# EasyEDA Pro project N01-H6.epro, schematic Schematic1_1, sheets 1 to 5 of 7

## Sheets
1 Lpddr3: Assembly Variant: Basic; Board Name: Board1_1; Create Date: 2026-11-21; Page Name: Lpddr3; Project Name: N01｜全志 H6 Linux 主板; Schematic Name: Schematic1_1; Update Date: 2026-11-21; Company: 嘉立创EDA; Page Size: A4; Version: V1.0
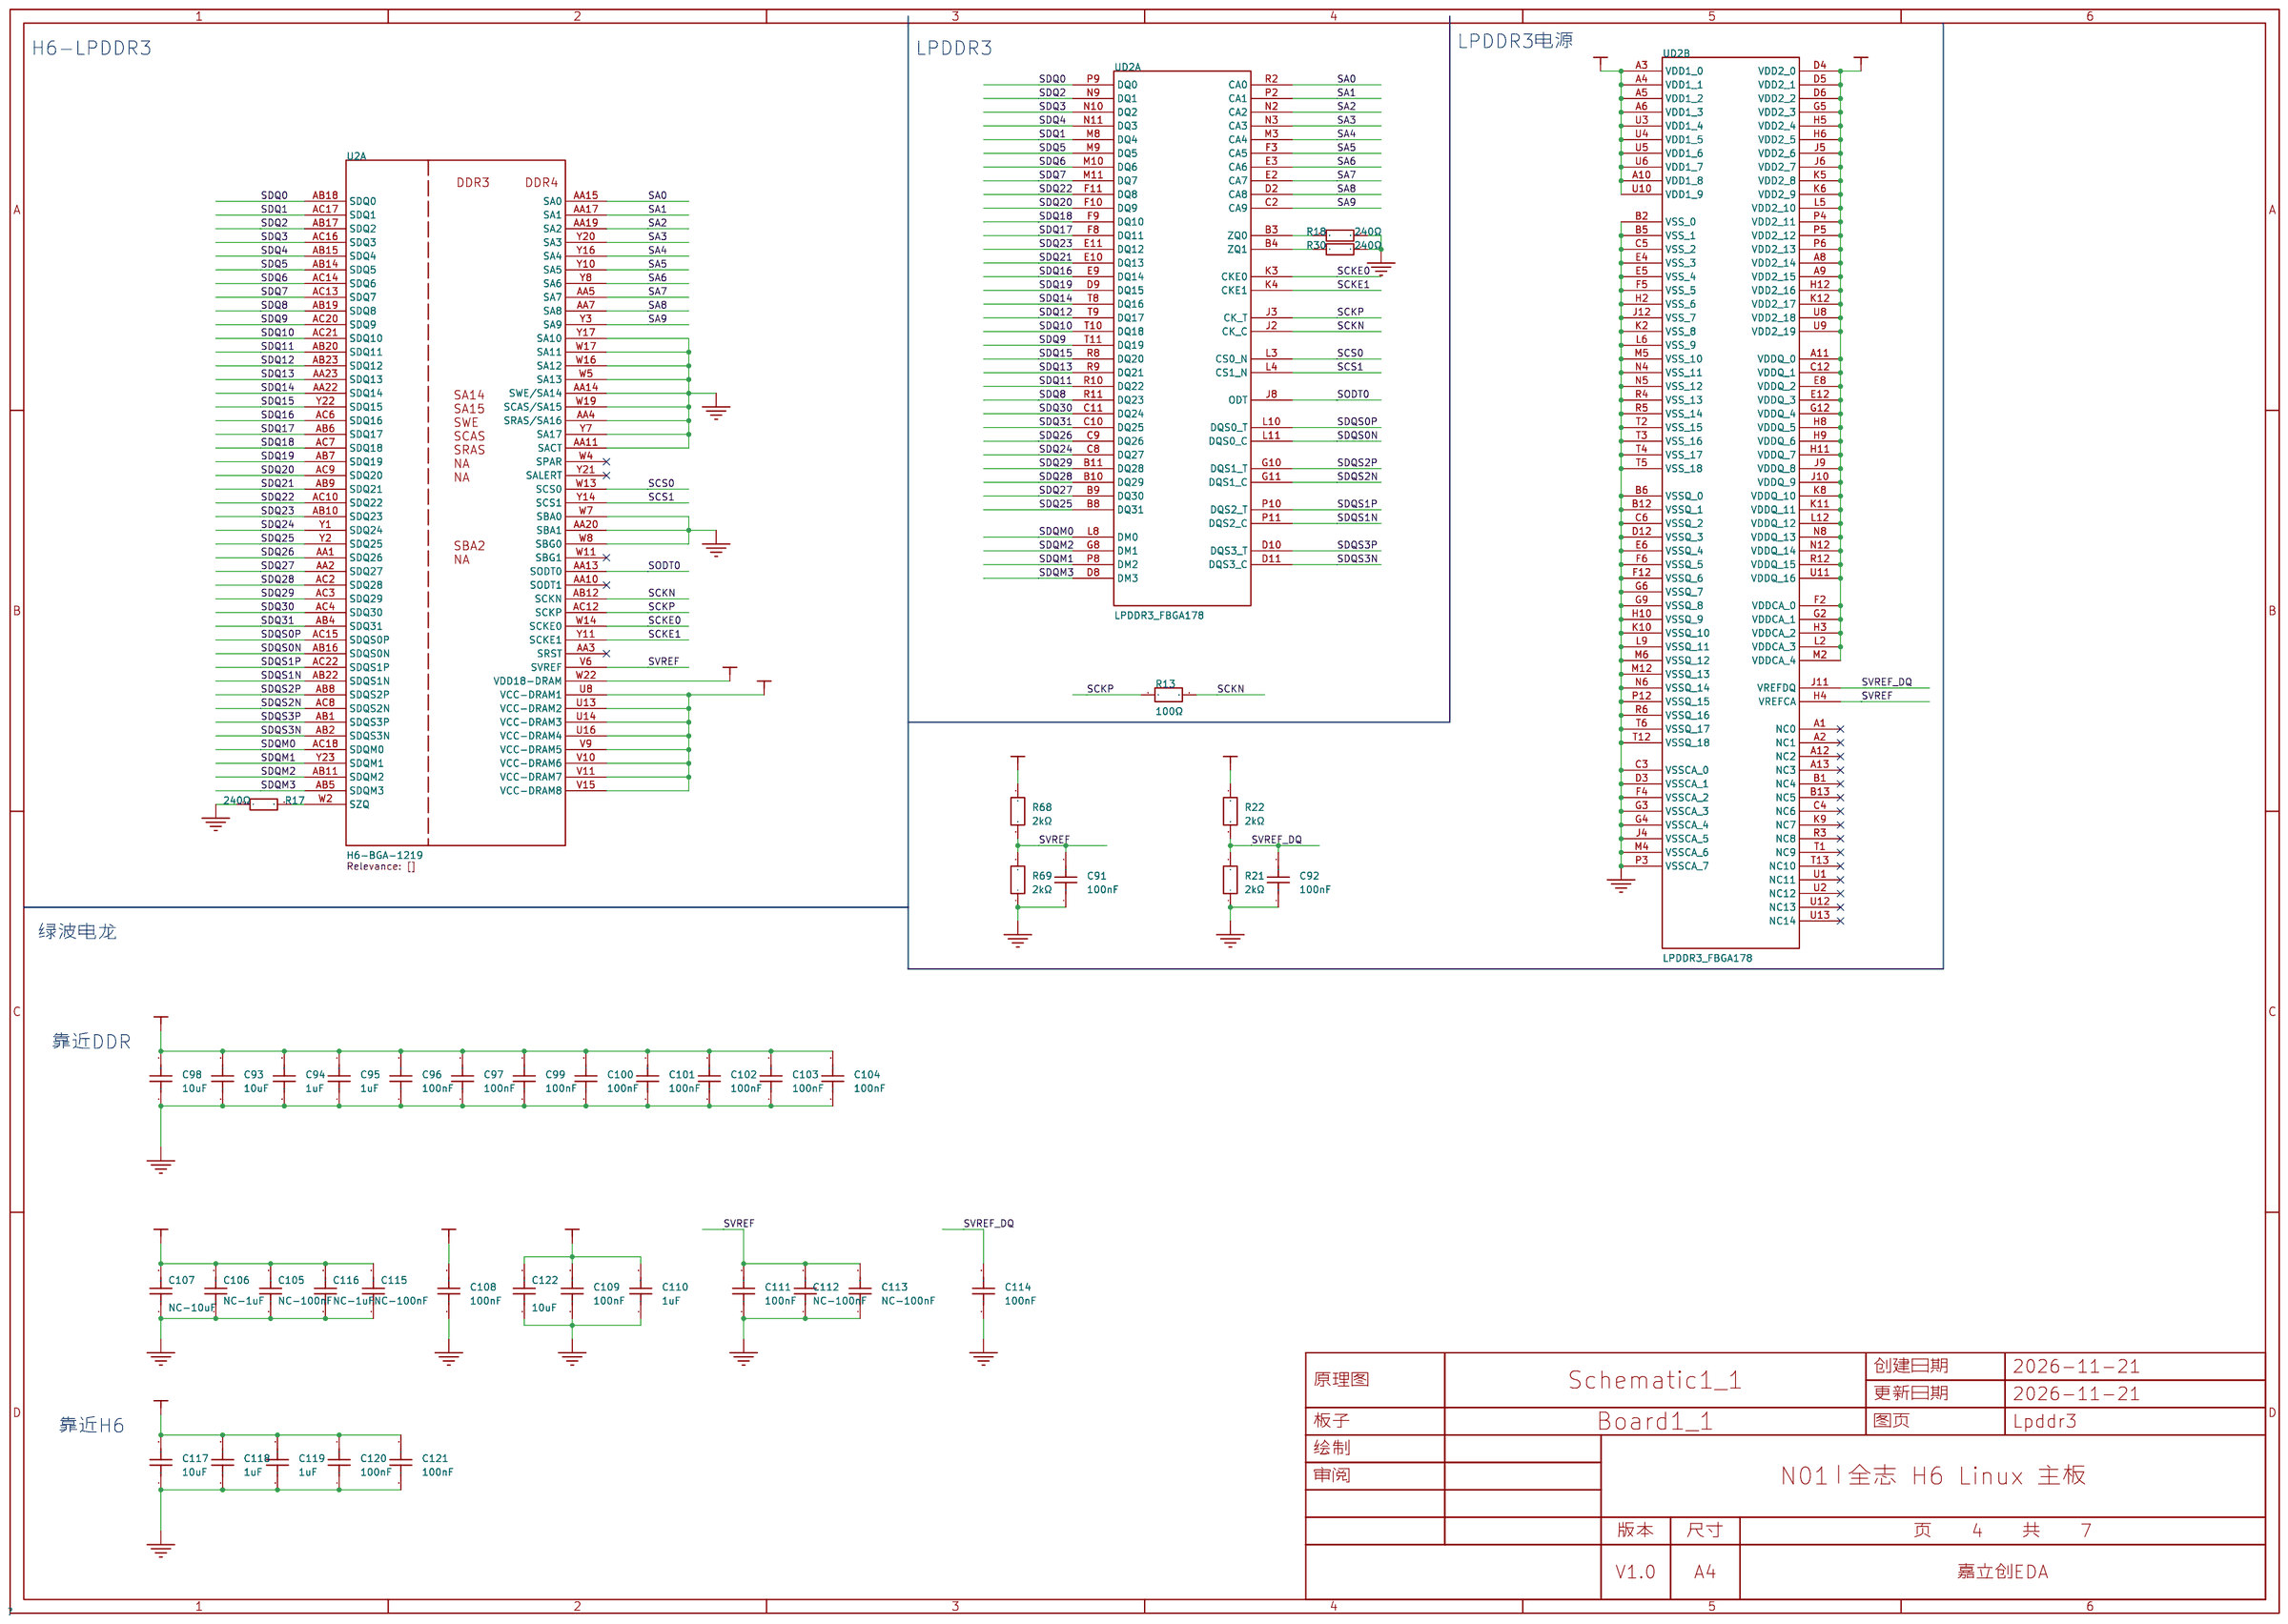
[diagram p0: Lpddr3]
2 ETH,HDMI: Page Name: ETH,HDMI
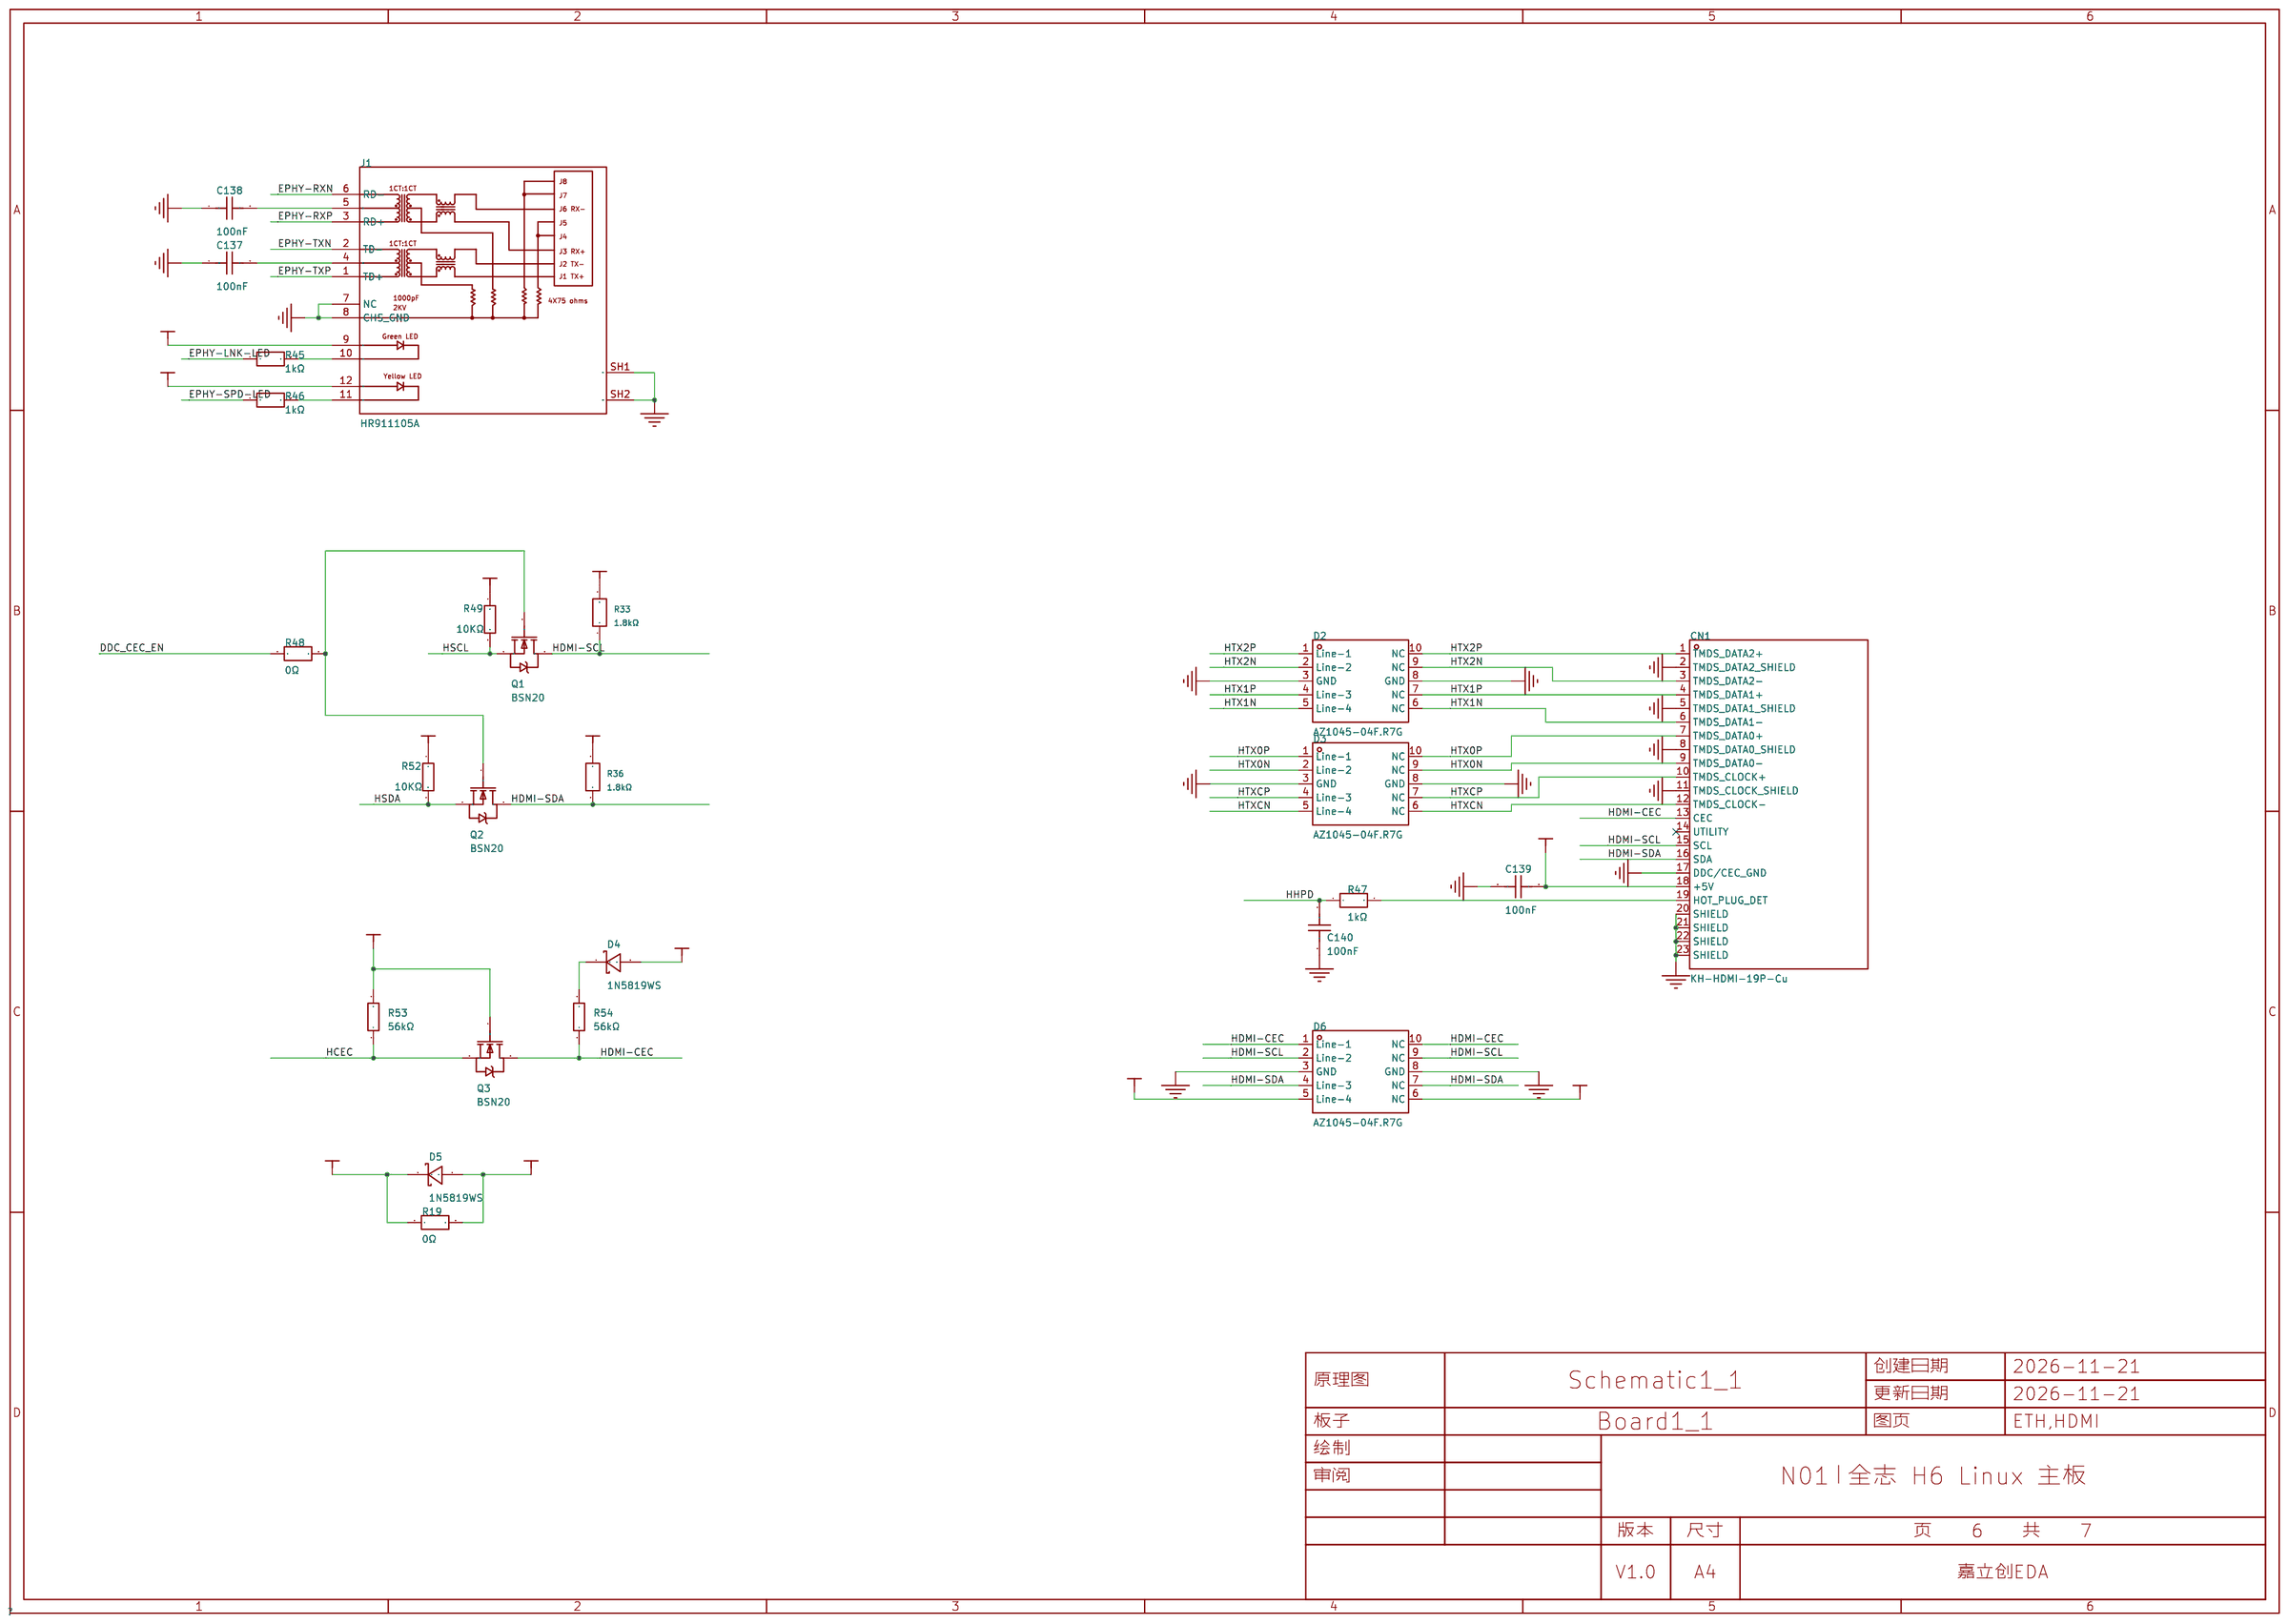
[diagram p1: ETH,HDMI]
3 Power_Tree_1: Page Name: Power_Tree_1
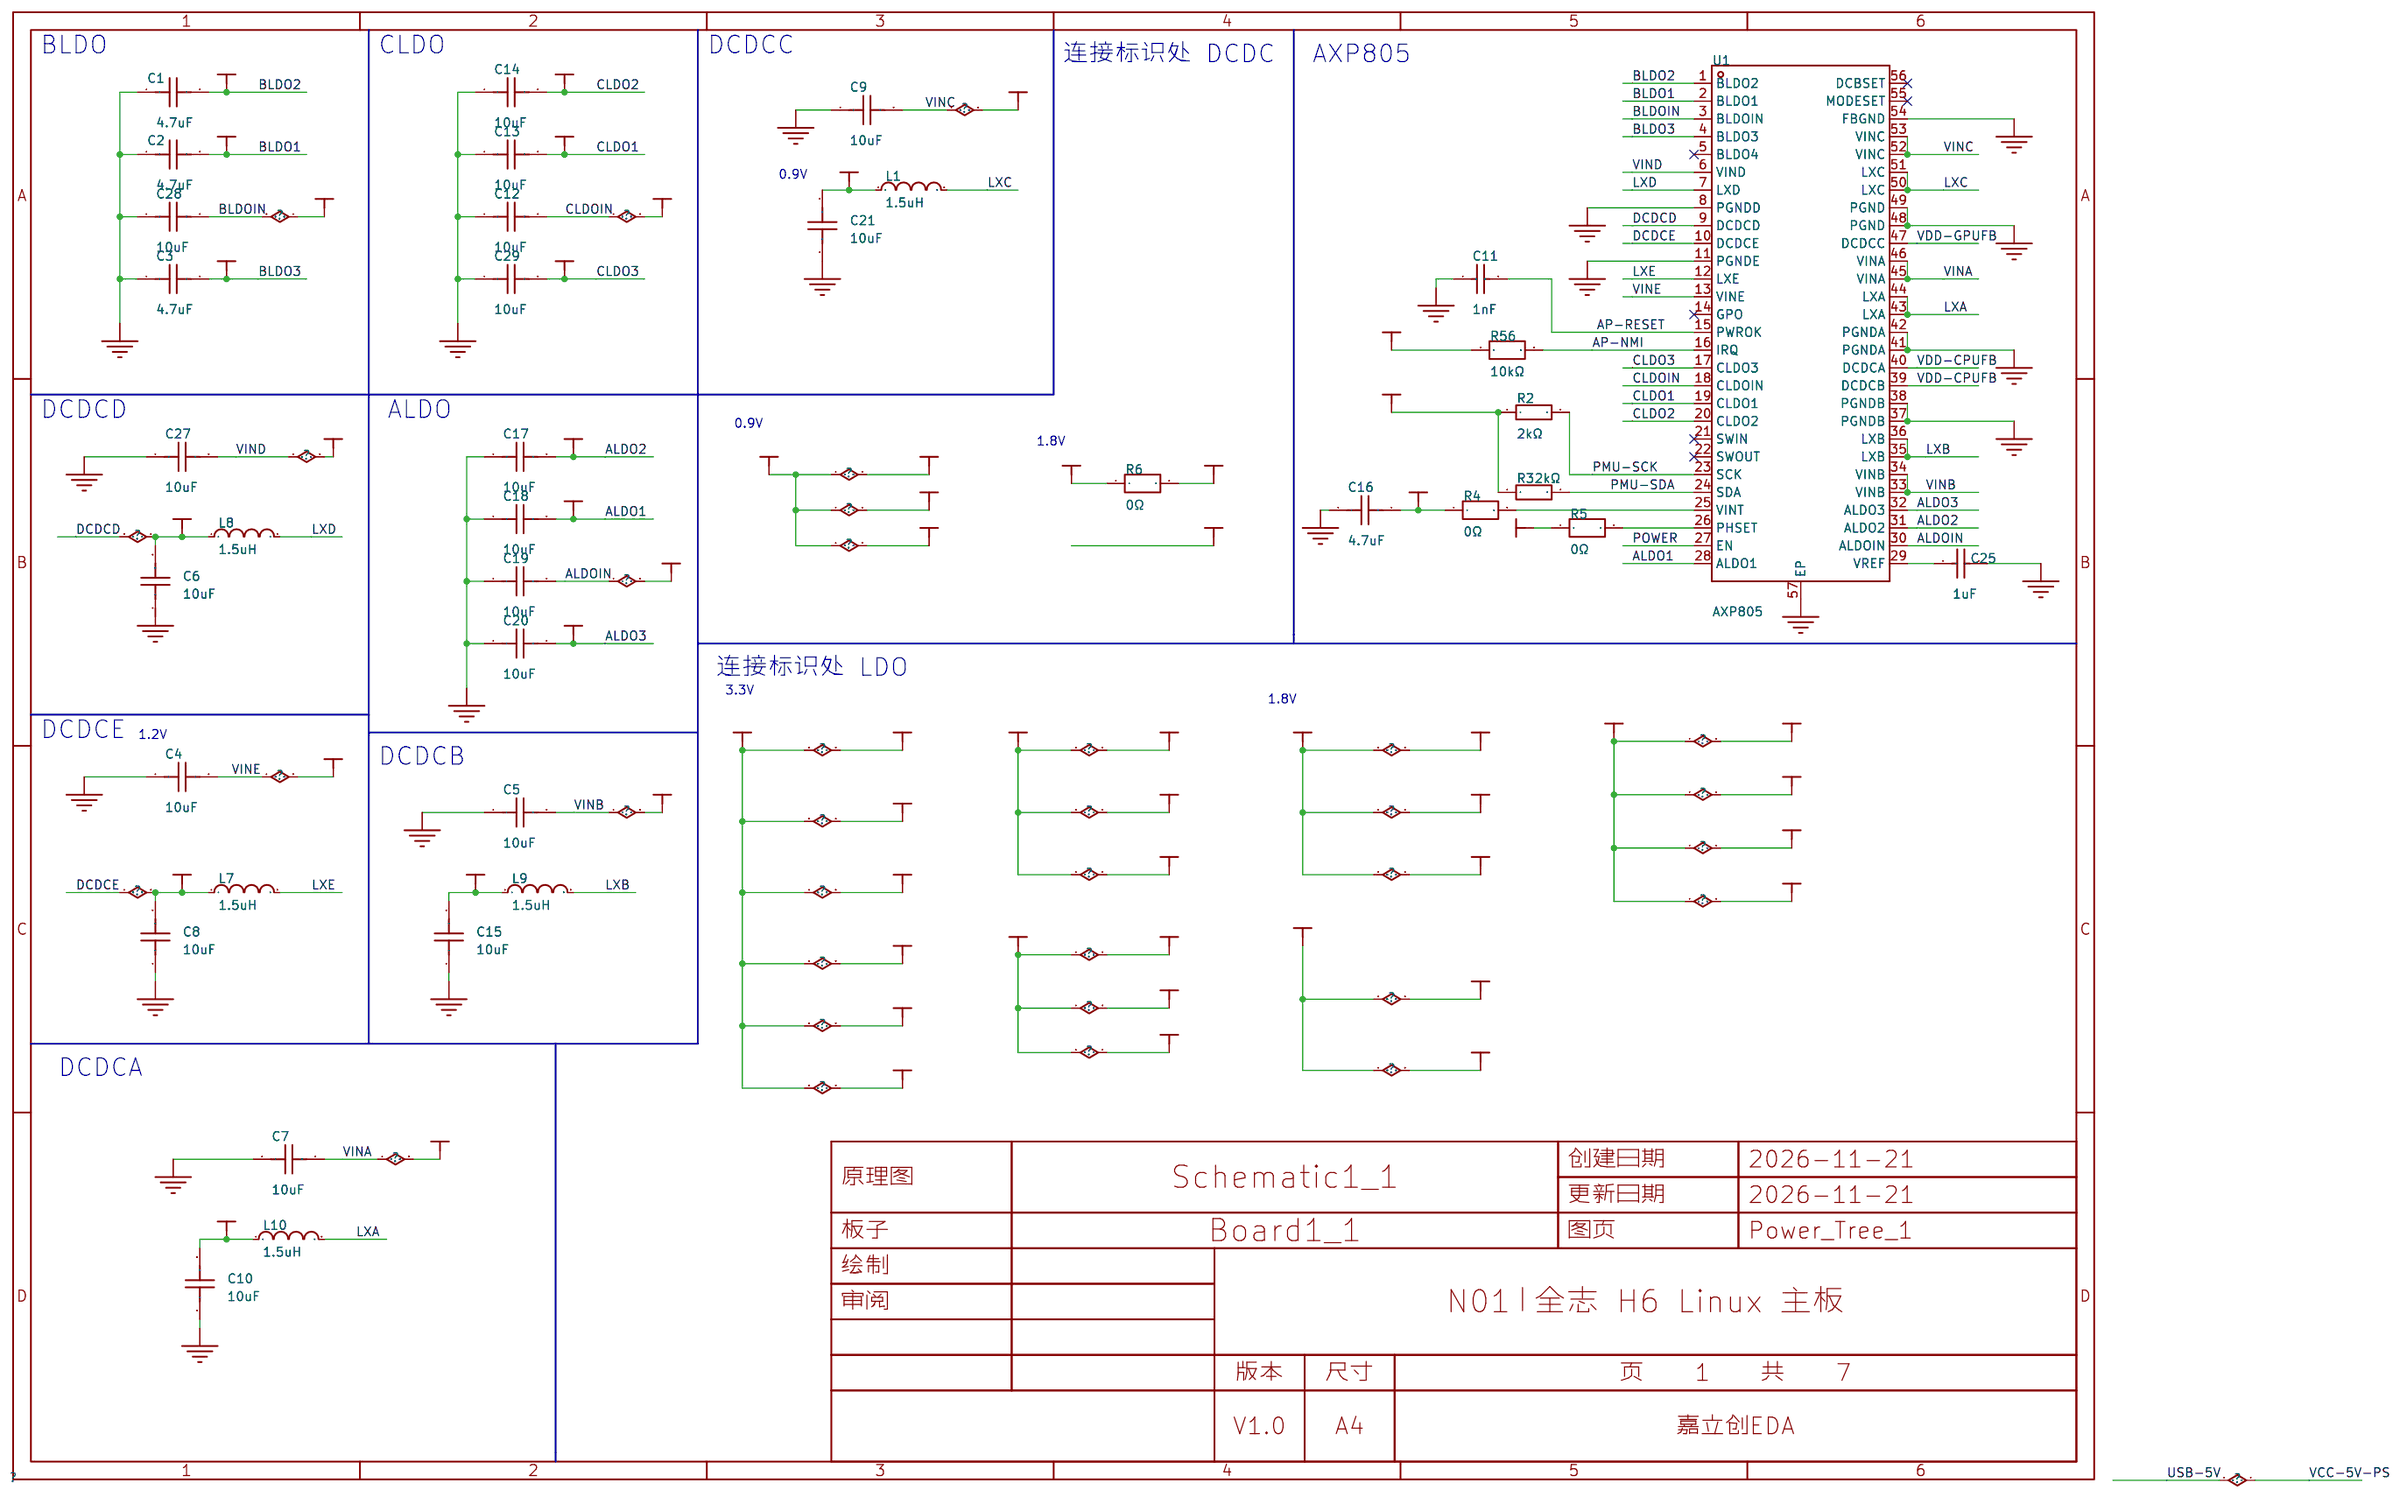
[diagram p2: Power_Tree_1]
4 H6_SOC_2: Page Name: H6_SOC_2
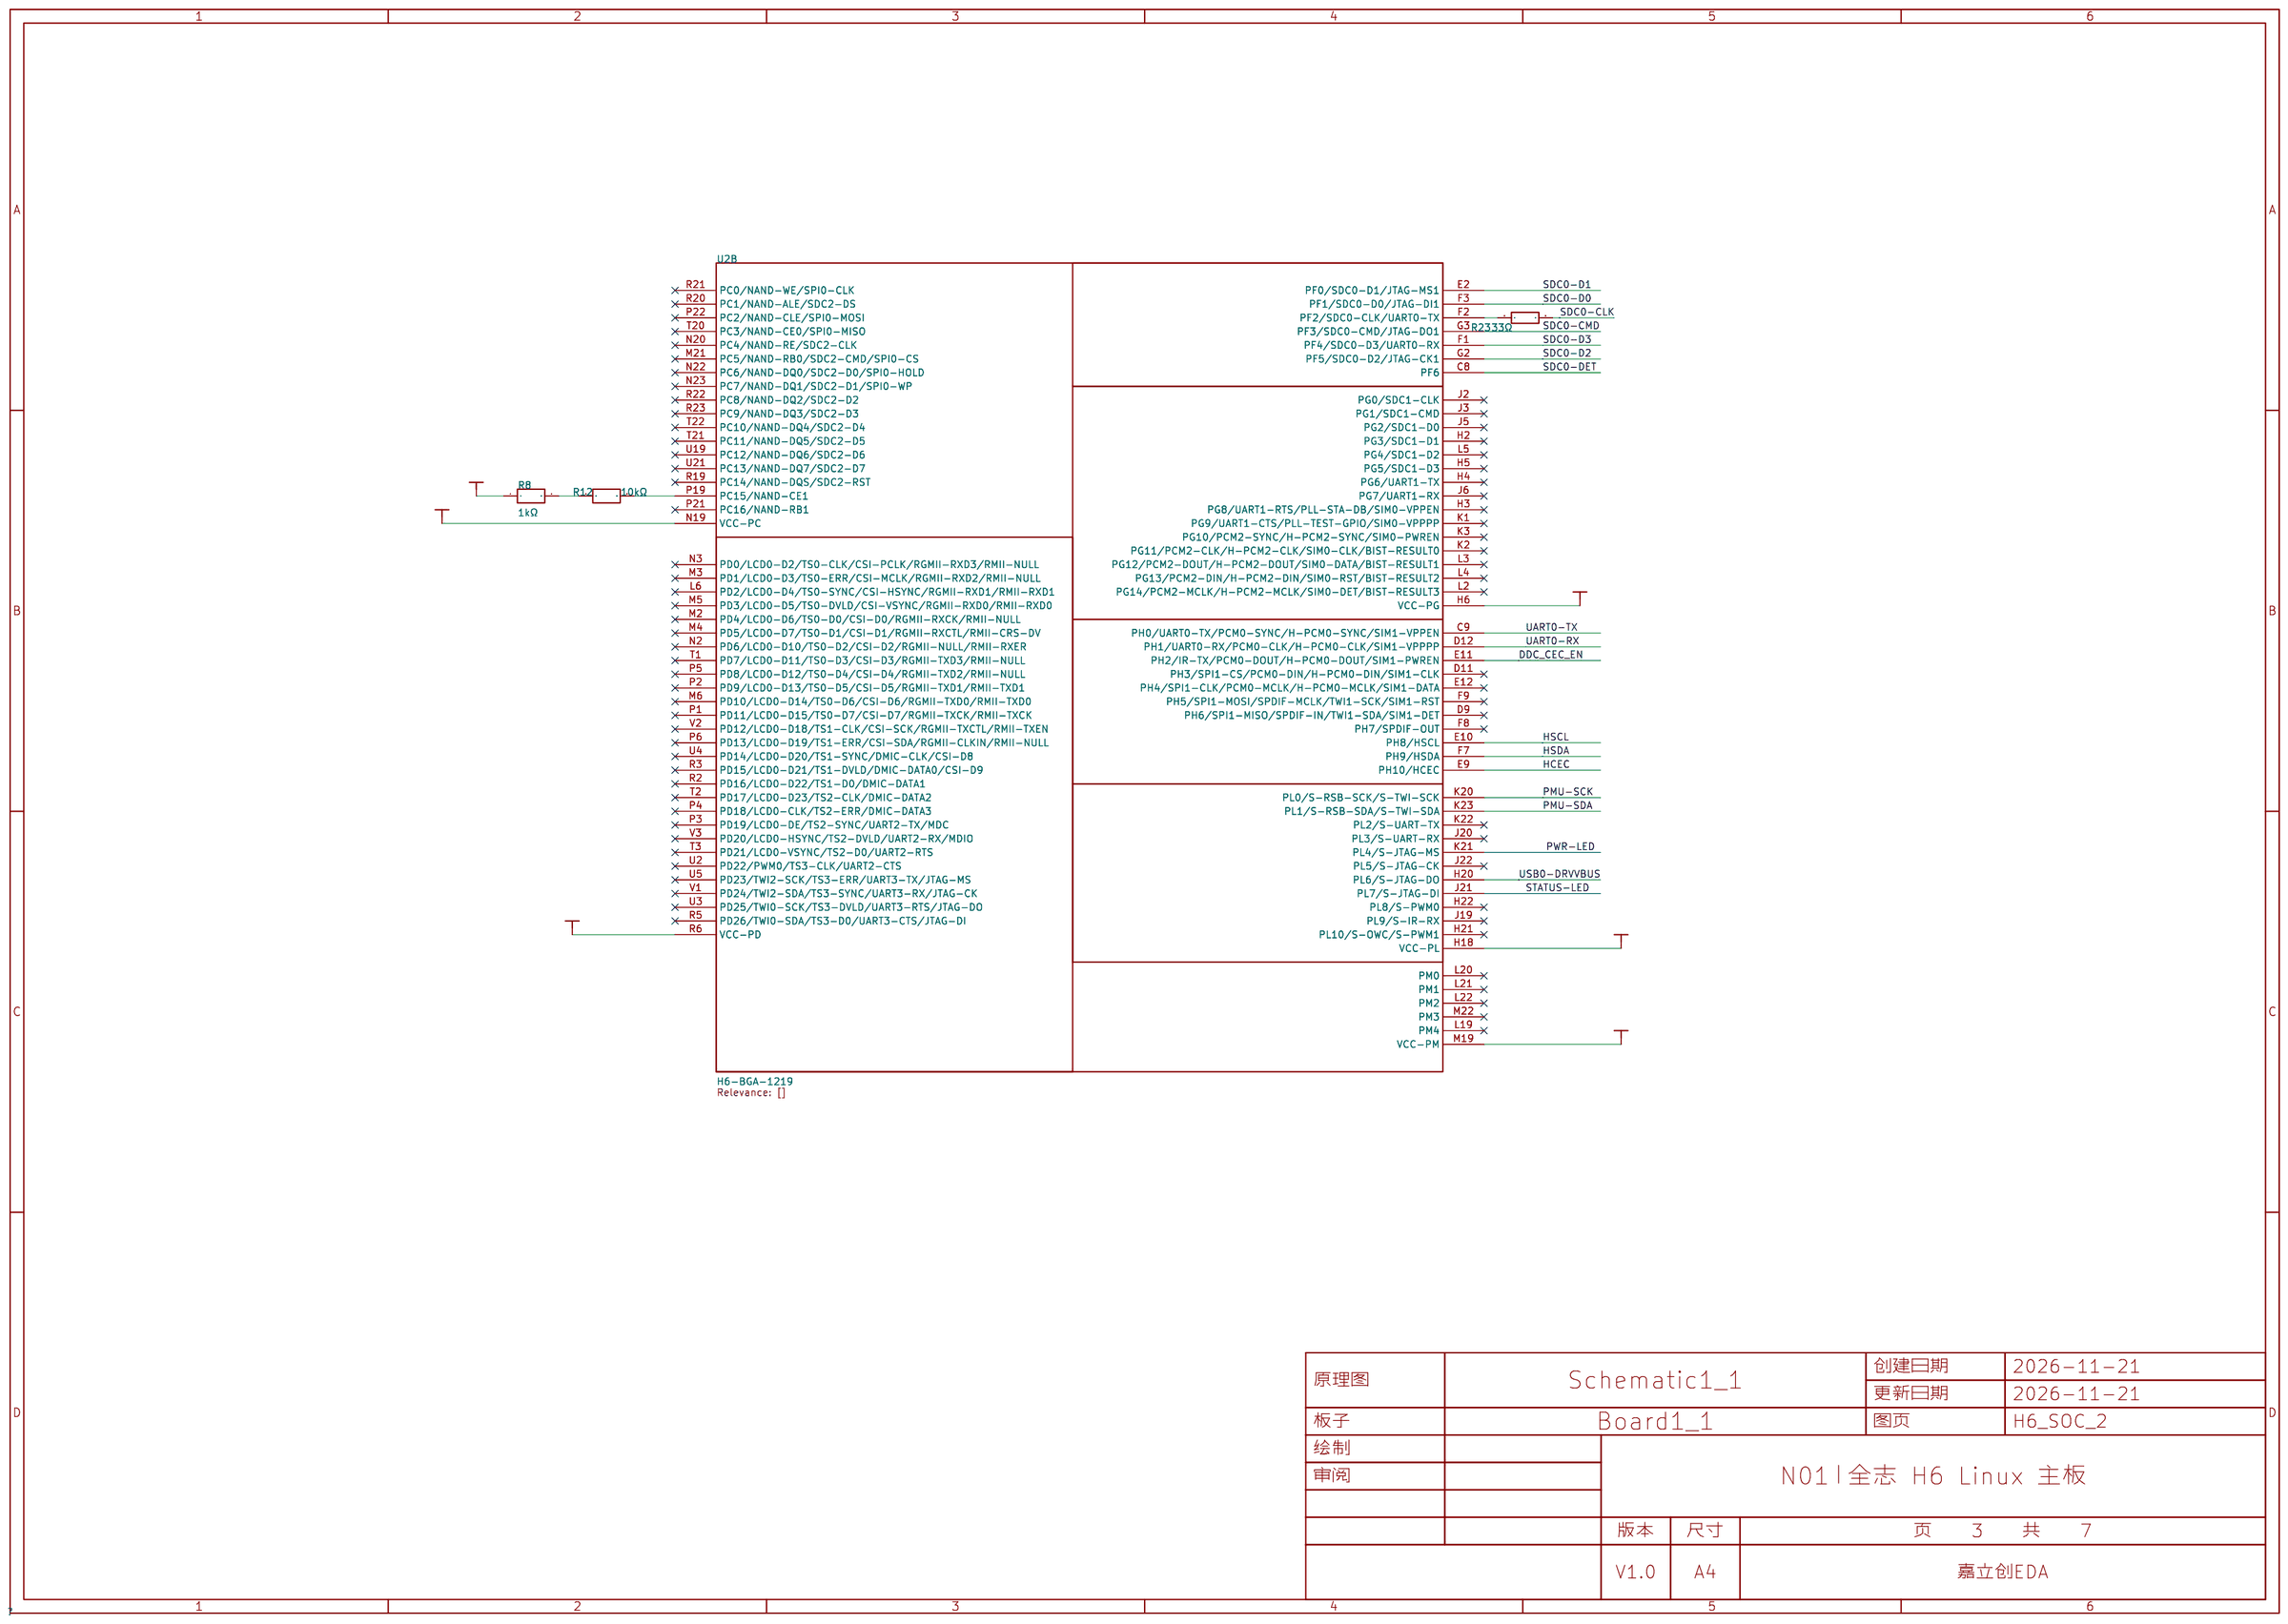
[diagram p3: H6_SOC_2]
5 H6_SOC_1: Page Name: H6_SOC_1
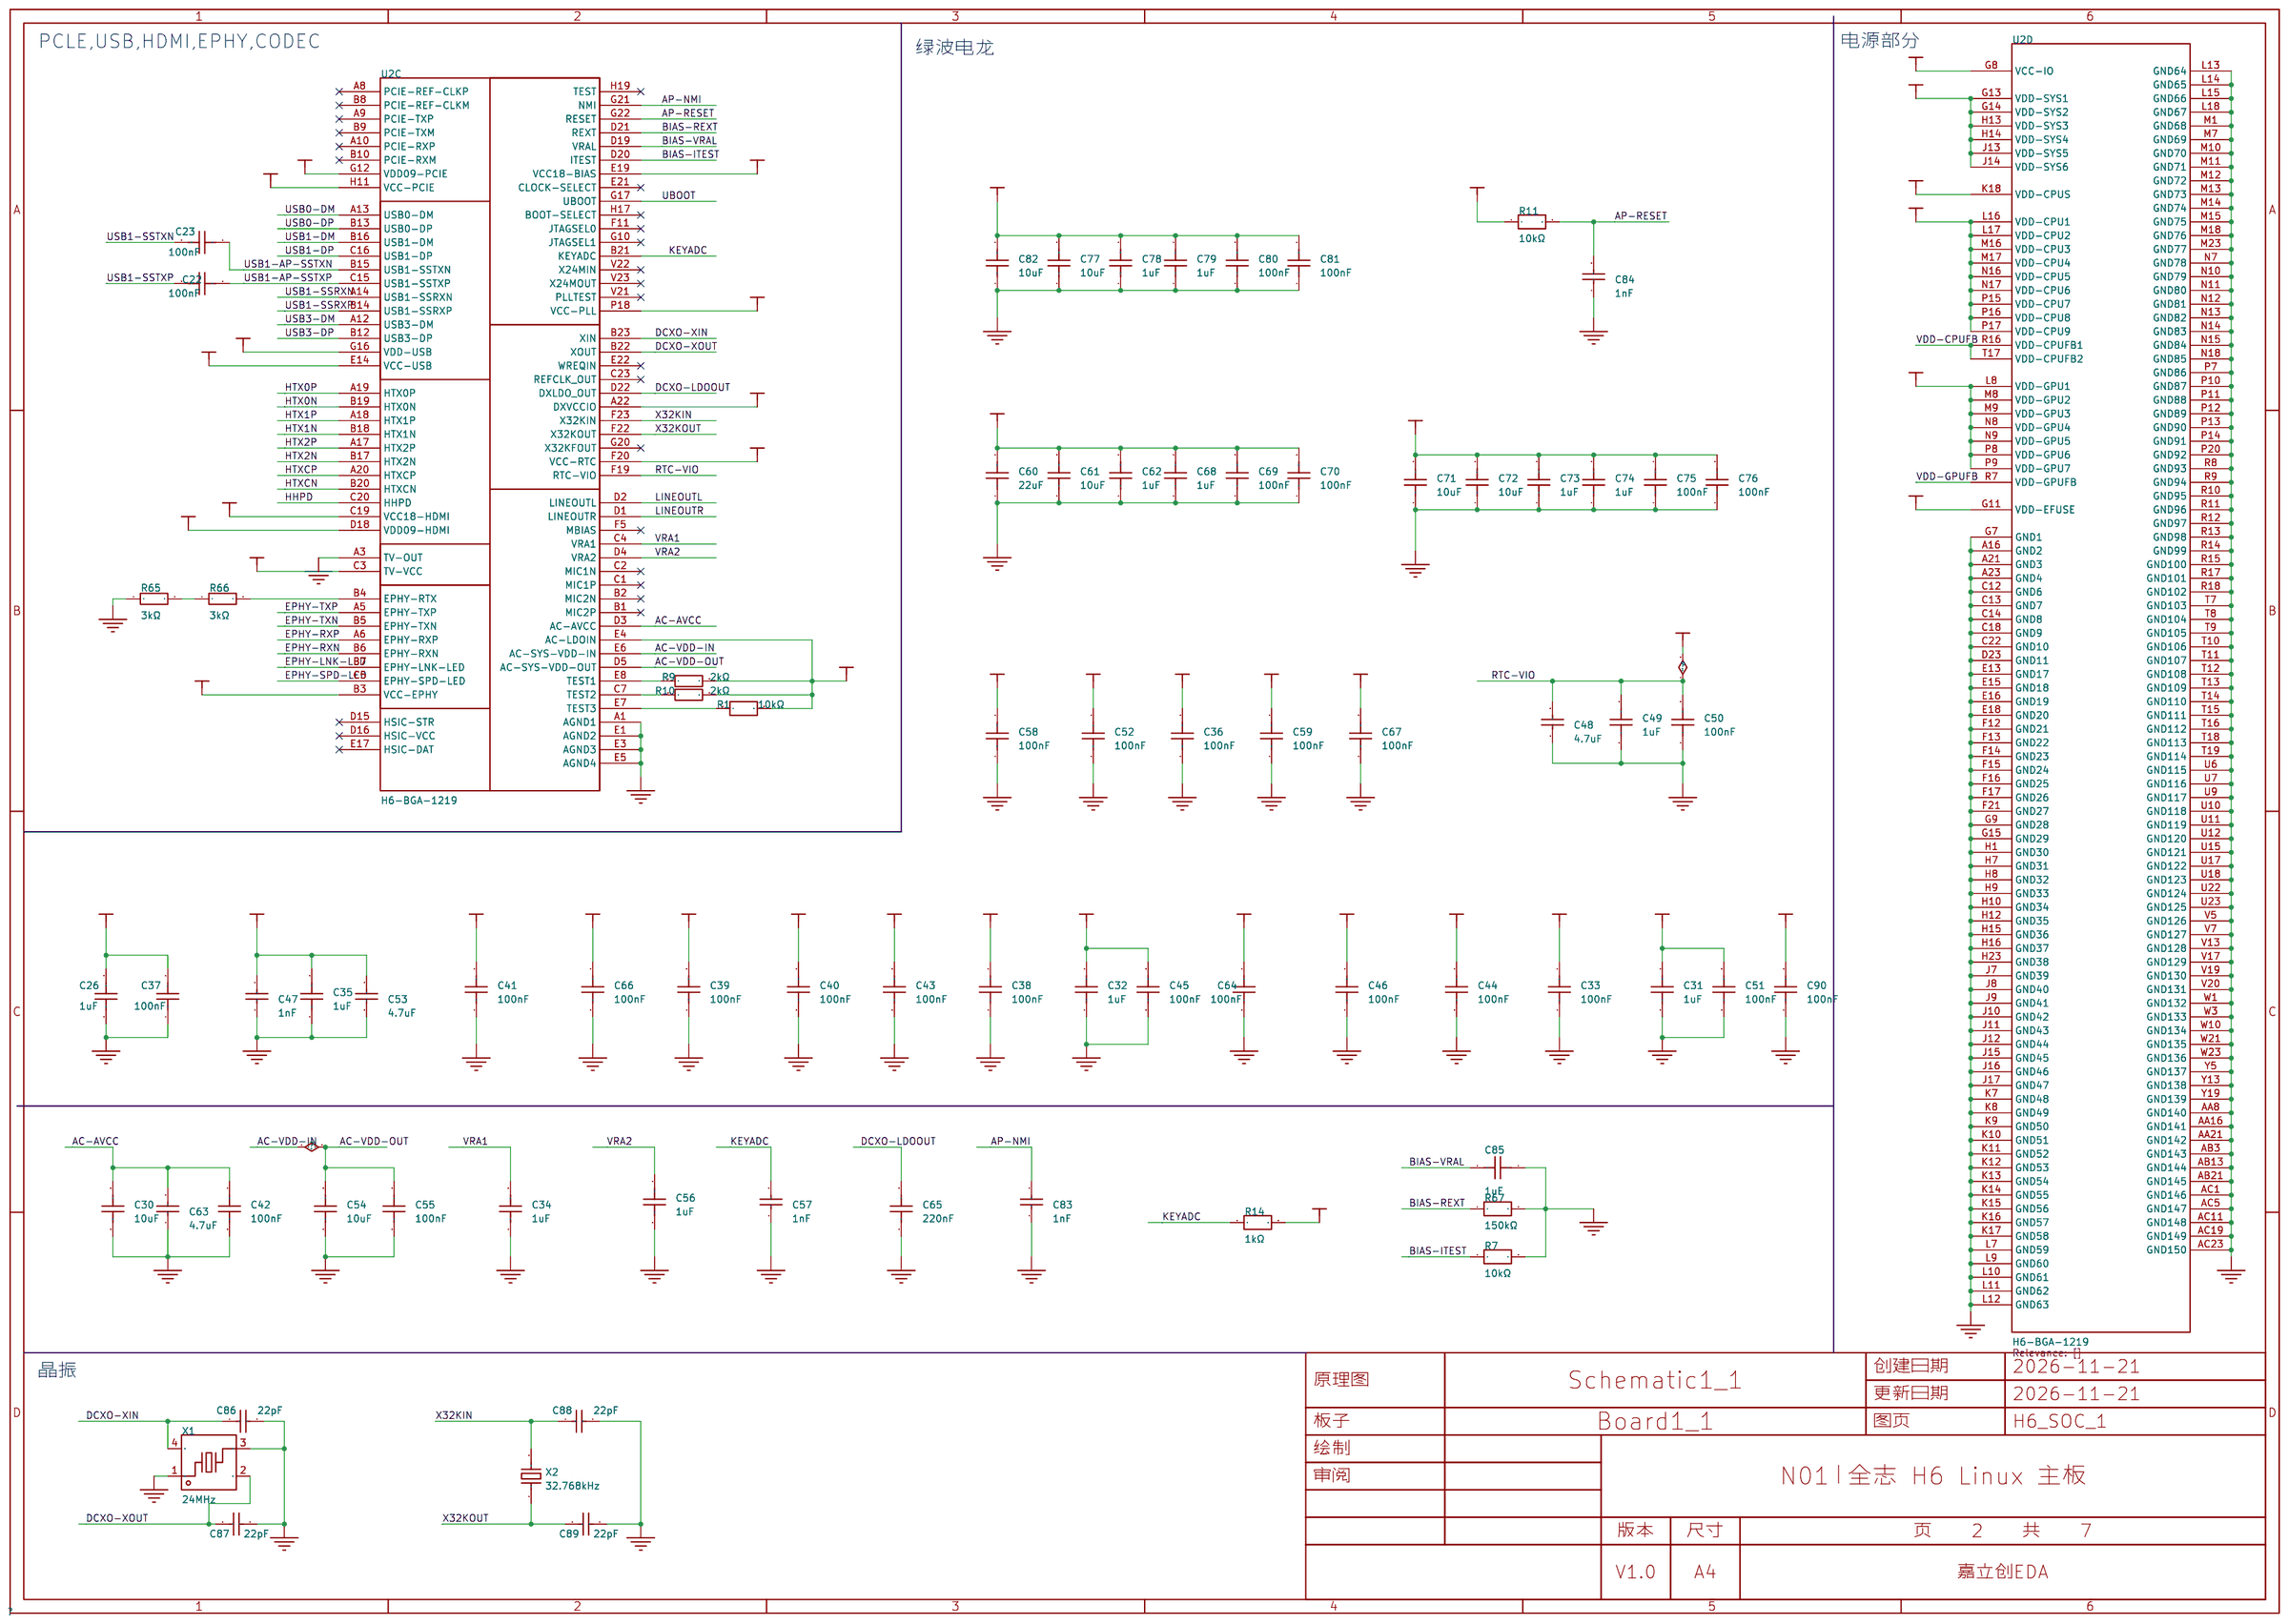
[diagram p4: H6_SOC_1]

## Parts
sheet ETH,HDMI
C137  100nF  [C0603]
C138  100nF  [C0603]
C139  100nF  [C0402]
C140  100nF  [C0402]
CN1  KH-HDMI-19P-Cu  [HDMI-SMD_KH-HDMI-19P-CU]
D2  AZ1045-04F.R7G  [DFN2510-10_L2.5-W1.0-P0.50-BL]
D3  AZ1045-04F.R7G  [DFN2510-10_L2.5-W1.0-P0.50-BL]
D4  1N5819WS  [SOD-323_L1.8-W1.3-LS2.5-RD]
D5  1N5819WS  [SOD-323_L1.8-W1.3-LS2.5-RD]
D6  AZ1045-04F.R7G  [DFN2510-10_L2.5-W1.0-P0.50-BL]
J1  HR911105A  [RJ45-TH_HR911105A]
Q1  BSN20  [SOT-23-3_L2.9-W1.6-P1.90-LS2.8-BR]
Q2  BSN20  [SOT-23-3_L2.9-W1.6-P1.90-LS2.8-BR]
Q3  BSN20  [SOT-23-3_L2.9-W1.6-P1.90-LS2.8-BR]
R19  0Ω  [R0805]
R33  1.8kΩ  [R0805]
R36  1.8kΩ  [R0805]
R45  1kΩ  [R0805]
R46  1kΩ  [R0805]
R47  1kΩ  [R0805]
R48  0Ω  [R0805]
R49  10KΩ  [R0805]
R52  10KΩ  [R0805]
R53  56kΩ  [R0805]
R54  56kΩ  [R0805]
sheet H6_SOC_1
C22  100nF  [C0402]
C23  100nF  [C0402]
C26  1uF  [C0402]
C30  10uF  [C0603]
C31  1uF  [C0402]
C32  1uF  [C0402]
C33  100nF  [C0402]
C34  1uF  [C0402]
C35  1uF  [C0402]
C36  100nF  [C0402]
C37  100nF  [C0402]
C38  100nF  [C0402]
C39  100nF  [C0402]
C40  100nF  [C0402]
C41  100nF  [C0402]
C42  100nF  [C0402]
C43  100nF  [C0402]
C44  100nF  [C0402]
C45  100nF  [C0402]
C46  100nF  [C0402]
C47  1nF  [C0402]
C48  4.7uF  [C0603]
C49  1uF  [C0402]
C50  100nF  [C0402]
C51  100nF  [C0402]
C52  100nF  [C0402]
C53  4.7uF  [C0603]
C54  10uF  [C0603]
C55  100nF  [C0402]
C56  1uF  [C0402]
C57  1nF  [C0402]
C58  100nF  [C0402]
C59  100nF  [C0402]
C60  22uF  [C0603]
C61  10uF  [C0603]
C62  1uF  [C0402]
C63  4.7uF  [C0603]
C64  100nF  [C0402]
C65  220nF  [C0402]
C66  100nF  [C0402]
C67  100nF  [C0402]
C68  1uF  [C0402]
C69  100nF  [C0402]
C70  100nF  [C0402]
C71  10uF  [C0603]
C72  10uF  [C0603]
C73  1uF  [C0402]
C74  1uF  [C0402]
C75  100nF  [C0402]
C76  100nF  [C0402]
C77  10uF  [C0603]
C78  1uF  [C0402]
C79  1uF  [C0402]
C80  100nF  [C0402]
C81  100nF  [C0402]
C82  10uF  [C0603]
C83  1nF  [C0402]
C84  1nF  [C0402]
C85  1uF  [C0402]
C86  22pF  [C0402]
C87  22pF  [C0402]
C88  22pF  [C0402]
C89  22pF  [C0402]
C90  100nF  [C0402]
R1  10kΩ  [R0805]
R7  10kΩ  [R0805]
R9  2kΩ  [R0805]
R10  2kΩ  [R0805]
R11  10kΩ  [R0805]
R14  1kΩ  [R0805]
R65  3kΩ  [R0805]
R66  3kΩ  [R0805]
R67  150kΩ  [R0805]
U2  1  [H6_BGA451]  (sections 1,2,3,4)
X1  24MHz  [CRYSTAL-SMD_4P-L3.2-W2.5-BL]
X2  32.768kHz  [OSC-SMD_L3.2-W1.5]
sheet H6_SOC_2
R8  1kΩ  [R0805]
R12  10kΩ  [R0805]
R23  33Ω  [R0805]
sheet Lpddr3
C91  100nF  [C0402]
C92  100nF  [C0402]
C93  10uF  [C0603]
C94  1uF  [C0402]
C95  1uF  [C0402]
C96  100nF  [C0402]
C97  100nF  [C0402]
C98  10uF  [C0603]
C99  100nF  [C0402]
C100  100nF  [C0402]
C101  100nF  [C0402]
C102  100nF  [C0402]
C103  100nF  [C0402]
C104  100nF  [C0402]
C105  NC-100nF  [C0402]
C106  NC-1uF  [C0402]
C107  NC-10uF  [C0603]
C108  100nF  [C0402]
C109  100nF  [C0402]
C110  1uF  [C0402]
C111  100nF  [C0402]
C112  NC-100nF  [C0402]
C113  NC-100nF  [C0402]
C114  100nF  [C0402]
C115  NC-100nF  [C0402]
C116  NC-1uF  [C0402]
C117  10uF  [C0603]
C118  1uF  [C0402]
C119  1uF  [C0402]
C120  100nF  [C0402]
C121  100nF  [C0402]
C122  10uF  [C0603]
R13  100Ω  [R0805]
R17  240Ω  [R0805]
R18  240Ω  [R0805]
R21  2kΩ  [R0402]
R22  2kΩ  [R0402]
R30  240Ω  [R0805]
R68  2kΩ  [R0402]
R69  2kΩ  [R0402]
UD2  1  [LPDDR3_FBGA178]  (sections 1,2)
sheet Power_Tree_1
C1  4.7uF  [C0603]
C2  4.7uF  [C0603]
C3  4.7uF  [C0603]
C4  10uF  [C0603]
C5  10uF  [C0603]
C6  10uF  [C0603]
C7  10uF  [C0603]
C8  10uF  [C0603]
C9  10uF  [C0603]
C10  10uF  [C0603]
C11  1nF  [C0603]
C12  10uF  [C0603]
C13  10uF  [C0603]
C14  10uF  [C0603]
C15  10uF  [C0603]
C16  4.7uF  [C0603]
C17  10uF  [C0603]
C18  10uF  [C0603]
C19  10uF  [C0603]
C20  10uF  [C0603]
C21  10uF  [C0603]
C25  1uF  [C0603]
C27  10uF  [C0603]
C28  10uF  [C0603]
C29  10uF  [C0603]
L1  1.5uH  [IND-SMD_L4.4-W4.2]
L7  1.5uH  [IND-SMD_L4.4-W4.2]
L8  1.5uH  [IND-SMD_L4.4-W4.2]
L9  1.5uH  [IND-SMD_L4.4-W4.2]
L10  1.5uH  [IND-SMD_L4.4-W4.2]
R2  2kΩ  [R0805]
R3  2kΩ  [R0805]
R4  0Ω  [R0805]
R5  0Ω  [R0805]
R6  0Ω  [R0805]
R56  10kΩ  [R0805]
U1  AXP805  [QFN-56_L7.0-W7.0-P0.40-TL-EP5.2]

## Library data of the parts
C137 C138 = CC0603KRX7R9BB104: 容值:100nF;精度:±10%;额定电压:50V;温度系数:X7R;; LCSC Part Name: 100nF ±10% 50V; Supplier Part: C14663; Manufacturer: YAGEO(国巨); Supplier Footprint: 0603; JLCPCB Part Class: Basic Part; Datasheet: https://item.szlcsc.com/datasheet/CC0603KRX7R9BB104/15331.html; Supplier: LCSC; Tolerance: ±10%; Voltage Rating: 50V; Temperature Coefficient: X7R
C22 C23 C33 C36-C46 C50-C52 C55 C58 C59 C64 C66 C67 C69 C70 C75 C76 C80 C81 C90-C92 C96 C97 C99-C105 C108 C109 C111-C115 C120 C121 C139 C140 = CL05B104KO5NNNC: 容值:100nF;精度:±10%;额定电压:16V;温度系数:X7R;; LCSC Part Name: 100nF ±10% 16V; Supplier Part: C1525; Manufacturer: SAMSUNG(三星); Supplier Footprint: 0402; JLCPCB Part Class: Basic Part; Datasheet: https://item.szlcsc.com/datasheet/CL05B104KO5NNNC/1877.html; Supplier: LCSC; Tolerance: ±10%; Voltage Rating: 16V; Temperature Coefficient: X7R
CN1 = KH-HDMI-19P-Cu: HDMI高清头母座 19PIN 四脚插端子SMT; LCSC Part Name: HDMI-A 母 19P; Supplier Part: C709361; Manufacturer: kinghelm(金航标); Supplier Footprint: SMD; JLCPCB Part Class: Extended Part; Datasheet: https://item.szlcsc.com/datasheet/KH-HDMI-19P-Cu/747097.html; Supplier: LCSC; Connector Type: HDMI-A; Gender: 母; Number of Pins: 19P; Mounting Type: 卧贴
D2 D3 D6 = AZ1045-04F.R7G: 反向截止电压(Vrwm):5V;钳位电压:12V;峰值脉冲电流(Ipp):3.5A@8/20us;峰值脉冲功率(Ppp):30W@8/20us;击穿电压:6V;; LCSC Part Name: ESD 5V截止 峰值脉冲电流：3.5A@8/20us; Supplier Part: C356811; Manufacturer: AMAZING(晶焱); Supplier Footprint: DFN2510-10; JLCPCB Part Class: Extended Part; Datasheet: https://item.szlcsc.com/datasheet/AZ1045-04F.R7G/331915.html; Supplier: LCSC; Reverse Stand-Off Voltage (Vrwm): 5V; Clamping Voltage: 12V; Peak Pulse Current (Ipp): 3.5A@8/20us; Peak Pulse Power Dissipation (Ppp): 30W@8/20us; Voltage - Breakdown: 6V; Reverse Leakage Current (Ir): 1.5uA; Number of Channels: 四路; level of protection: IEC 61000-4-5；IEC 61000-4-2; Type: ESD; Junction Capacitance: 0.5pF
D4 D5 = 1N5819WS_C191023: 正向压降(Vf):600mV@1A;直流反向耐压(Vr):40V;整流电流:1A;; LCSC Part Name: 电压:40V 电流:1A; Supplier Part: C191023; Manufacturer: Hottech(合科泰); Supplier Footprint: SOD-323; JLCPCB Part Class: Basic Part; Datasheet: https://item.szlcsc.com/datasheet/1N5819WS/213850.html; Supplier: LCSC; Voltage - Forward(Vf@If): 600mV@1A; Voltage - DC Reverse(Vr): 40V; Current - Rectified: 1A; Non-Repetitive Peak Forward Surge Current: 25A
J1 = HR911105A_C12074: 连接器类型:RJ45插座;安装方式:弯插;端口数量:1;LED:带LED;屏蔽:有屏蔽;等级:-;触头材质:磷青铜;触头镀层:金;工作温度:0℃~+70℃;; LCSC Part Name: 弯插 带LED; Supplier Part: C12074; Manufacturer: HANRUN(汉仁); Supplier Footprint: 插件; JLCPCB Part Class: Extended Part; Datasheet: https://item.szlcsc.com/datasheet/HR911105A/12651.html; Supplier: LCSC; Connector Type: RJ45插座; Mounting Type: 弯插; Number of Ports: 1; LED: 带LED; Shielding: 有屏蔽; PoE: 不带PoE; Supplementary Features: 带滤波; Contact Material: 磷青铜; Contact Plating: 金; Operating Temperature: 0℃~+70℃
Q1-Q3 = BSN20_C116157: 数量:1个N沟道;漏源电压(Vdss):50V;连续漏极电流(Id):100mA;导通电阻(RDS(on)):10Ω@2.75V,0.2A;耗散功率(Pd):-;阈值电压(Vgs(th)):1.5V@250uA;; LCSC Part Name: 1个N沟道 耐压:50V 电流:0.1A; Supplier Part: C116157; Manufacturer: SHIKUES(时科); Supplier Footprint: SOT-23; JLCPCB Part Class: Extended Part; Datasheet: https://item.szlcsc.com/datasheet/BSN20/117410.html; Supplier: LCSC; Number: 1个N沟道; Drain to Source Voltage: 50V; Current - Continuous Drain(Id): 100mA; RDS(on): 10Ω@2.75V,0.2A; Gate Threshold Voltage (Vgs(th)): 1.5V@250uA; Input Capacitance(Ciss): 40pF; Reverse Transfer Capacitance (Crss@Vds): 10pF; Type: N沟道; Output Capacitance(Coss): 15pF
R4-R6 R19 R48 = RE0805FAR000: 电阻类型:合金电阻;阻值:0Ω;精度:±1%;功率:500mW;温度系数:±50ppm/℃;安装方式:贴片;; LCSC Part Name: 0Ω 0.5W 0805 ±1%; Supplier Part: C51934133; Manufacturer: JIERR(捷而瑞); Supplier Footprint: 0805; JLCPCB Part Class: Extended Part; Datasheet: https://item.szlcsc.com/datasheet/RE0805FAR000/54649545.html; Supplier: LCSC; Type: 合金电阻; Tolerance: ±1%; Power(Watts): 500mW; Temperature Coefficient: ±50ppm/℃; Mounting Type: 贴片
R33 R36 = FRP0805F1801TS: 电阻类型:厚膜电阻;阻值:1.8kΩ;精度:±1%;功率:250mW;工作电压:150V;温度系数:±100ppm/℃;; LCSC Part Name: 厚膜电阻 805 1.8KΩ ±1% 250mW; Supplier Part: C54102237; Manufacturer: FOJAN(富捷); Supplier Footprint: 0805; JLCPCB Part Class: Extended Part; Datasheet: https://item.szlcsc.com/datasheet/FRP0805F1801TS/57319617.html; Supplier: LCSC; Type: 厚膜电阻; Tolerance: ±1%; Power(Watts): 250mW; Voltage-Supply(Max): 150V; Temperature Coefficient: ±100ppm/℃; Operating Temperature: -55℃~+155℃
R8 R14 R45-R47 = FRC0805F1001TS: 电阻类型:厚膜电阻;阻值:1kΩ;精度:±1%;功率:125mW;工作电压:150V;温度系数:±100ppm/℃;; LCSC Part Name: 1kΩ ±1% 125mW 厚膜电阻; Supplier Part: C2907232; Manufacturer: FOJAN(富捷); Supplier Footprint: 0805; JLCPCB Part Class: Extended Part; Supplier: LCSC; Type: 厚膜电阻; Tolerance: ±1%; Power(Watts): 125mW; Voltage-Supply(Max): 150V; Temperature Coefficient: ±100ppm/℃; Operating Temperature: -55℃~+155℃
R49 R52 = 0805W8F1002T5E_C17414: 电阻类型:厚膜电阻;阻值:10kΩ;精度:±1%;功率:125mW;工作电压:150V;温度系数:±100ppm/℃;; LCSC Part Name: 10kΩ ±1% 125mW 厚膜电阻; Supplier Part: C17414; Manufacturer: UNI-ROYAL(厚声); Manufacturer Part: 0805W8F1002T5E; Supplier Footprint: 0805; JLCPCB Part Class: Basic Part; Datasheet: https://item.szlcsc.com/datasheet/0805W8F1002T5E/18102.html; Supplier: LCSC; Type: 厚膜电阻; Tolerance: ±1%; Power(Watts): 125mW; Voltage-Supply(Max): 150V; Temperature Coefficient: ±100ppm/℃; Operating Temperature: -55℃~+155℃
R53 R54 = 0805W8F5602T5E: 电阻类型:厚膜电阻;阻值:56kΩ;精度:±1%;功率:125mW;工作电压:150V;温度系数:±100ppm/℃;; LCSC Part Name: 56kΩ ±1% 125mW 厚膜电阻; Supplier Part: C17756; Manufacturer: UNI-ROYAL(厚声); Supplier Footprint: 0805; JLCPCB Part Class: Extended Part; Datasheet: https://item.szlcsc.com/datasheet/0805W8F5602T5E/18444.html; Supplier: LCSC; Type: 厚膜电阻; Tolerance: ±1%; Power(Watts): 125mW; Voltage-Supply(Max): 150V; Temperature Coefficient: ±100ppm/℃; Operating Temperature: -55℃~+155℃
C26 C31 C32 C34 C35 C49 C56 C62 C68 C73 C74 C78 C79 C85 C94 C95 C106 C110 C116 C118 C119 = HGC0402R5105K500NTEJ: 容值:1uF;精度:±10%;额定电压:50V;温度系数:X5R;; LCSC Part Name: 1uF ±10% 50V; Supplier Part: C7472948; Manufacturer: Chinocera(华瓷); Supplier Footprint: 0402; JLCPCB Part Class: Extended Part; Datasheet: https://item.szlcsc.com/datasheet/HGC0402R5105K500NTEJ/8532795.html; Supplier: LCSC; Tolerance: ±10%; Voltage Rating: 50V; Temperature Coefficient: X5R
C4-C10 C12-C15 C17-C21 C27-C30 C54 C61 C71 C72 C77 C82 C93 C98 C107 C117 C122 = FCC0603X106K100CT: 容值:10uF;精度:±10%;额定电压:10V;温度系数:X5R;; LCSC Part Name: 10uF ±10% 10V; Supplier Part: C5137565; Manufacturer: FOJAN(富捷); Supplier Footprint: 0603; JLCPCB Part Class: Extended Part; Datasheet: https://item.szlcsc.com/datasheet/FCC0603X106K100CT/5747017.html; Supplier: LCSC; Tolerance: ±10%; Voltage Rating: 10V; Temperature Coefficient: X5R
C47 C57 C83 C84 = CC0402KRX7R9BB102: 容值:1nF;精度:±10%;额定电压:50V;材质(温度系数):X7R;; LCSC Part Name: 1nF ±10% 50V; Supplier Part: C106205; Manufacturer: YAGEO(国巨); Supplier Footprint: 0402; JLCPCB Part Class: Extended Part; Datasheet: https://atta.szlcsc.com/upload/public/pdf/source/20181008/C309510_22F155564471FAF6A489F7D68F34234E.pdf; Supplier: LCSC; Tolerance: ±10%; Voltage Rated: 50V; Temperature Coefficient: X7R
C48 C53 C63 = CL10A475KP8NNNC: 容值:4.7uF;精度:±10%;额定电压:10V;温度系数:X5R;; LCSC Part Name: 4.7uF ±10% 10V; Supplier Part: C1705; Manufacturer: SAMSUNG(三星); Supplier Footprint: 0603; JLCPCB Part Class: Extended Part; Datasheet: https://item.szlcsc.com/datasheet/CL10A475KP8NNNC/2057.html; Supplier: LCSC; Tolerance: ±10%; Voltage Rating: 10V; Temperature Coefficient: X5R
C60 = HGC0603R5226M100NTHJ: 容值:22uF;精度:±20%;额定电压:10V;温度系数:X5R;; LCSC Part Name: 22uF ±20% 10V; Supplier Part: C7432770; Manufacturer: Chinocera(华瓷); Supplier Footprint: 0603; JLCPCB Part Class: Extended Part; Datasheet: https://item.szlcsc.com/datasheet/HGC0603R5226M100NTHJ/8438252.html; Supplier: LCSC; Tolerance: ±20%; Voltage Rating: 10V; Temperature Coefficient: X5R
C65 = GRM155R61H224KE01D: 容值:220nF;精度:±10%;额定电压:50V;温度系数:X5R;; LCSC Part Name: 220nF ±10% 50V; Supplier Part: C5159775; Manufacturer: muRata(村田); Supplier Footprint: 0402; JLCPCB Part Class: Extended Part; Datasheet: https://item.szlcsc.com/datasheet/GRM155R61H224KE01D/5803626.html; Supplier: LCSC; Tolerance: ±10%; Voltage Rating: 50V; Temperature Coefficient: X5R
C86-C89 = CC0402JRNPO9BN220: 容值:22pF;精度:±5%;额定电压:50V;温度系数:NP0;; LCSC Part Name: 22pF ±5% 50V; Supplier Part: C106203; Manufacturer: YAGEO(国巨); Supplier Footprint: 0402; JLCPCB Part Class: Extended Part; Datasheet: https://item.szlcsc.com/datasheet/CC0402JRNPO9BN220/107418.html; Supplier: LCSC; Tolerance: ±5%; Voltage Rating: 50V; Temperature Coefficient: NP0
R1 R7 R11 R12 R56 = FRC0805F1002TS: 电阻类型:厚膜电阻;阻值:10kΩ;精度:±1%;功率:125mW;工作电压:150V;温度系数:±100ppm/℃;; LCSC Part Name: 10kΩ ±1% 125mW 厚膜电阻; Supplier Part: C2907219; Manufacturer: FOJAN(富捷); Supplier Footprint: 0805; JLCPCB Part Class: Extended Part; Supplier: LCSC; Type: 厚膜电阻; Tolerance: ±1%; Power(Watts): 125mW; Voltage-Supply(Max): 150V; Temperature Coefficient: ±100ppm/℃; Operating Temperature: -55℃~+155℃
R2 R3 R9 R10 = RC0805FR-072KL: 电阻类型:厚膜电阻;阻值:2kΩ;精度:±1%;功率:125mW;最大工作电压:150V;温度系数:±100ppm/℃;; LCSC Part Name: 厚膜电阻 2kΩ ±1% 125mW; Supplier Part: C114572; Manufacturer: YAGEO(国巨); Supplier Footprint: 0805; JLCPCB Part Class: Extended Part; Datasheet: https://atta.szlcsc.com/upload/public/pdf/source/20170815/C125758_1502799027253889202.pdf; Supplier: LCSC; Type: 厚膜电阻; Tolerance: ±1%; Power(Watts): 125mW; Overload Voltage (Max): 150V; Temperature Coefficient: ±100ppm/℃; Operating Temperature Range: -55℃~+155℃
R65 R66 = 0805W8F3001T5E: 电阻类型:厚膜电阻;阻值:3kΩ;精度:±1%;功率:125mW;工作电压:150V;温度系数:±100ppm/℃;; LCSC Part Name: 3kΩ ±1% 125mW 厚膜电阻; Supplier Part: C17661; Manufacturer: UNI-ROYAL(厚声); Supplier Footprint: 0805; JLCPCB Part Class: Basic Part; Datasheet: https://item.szlcsc.com/datasheet/0805W8F3001T5E/18349.html; Supplier: LCSC; Type: 厚膜电阻; Tolerance: ±1%; Power(Watts): 125mW; Voltage-Supply(Max): 150V; Temperature Coefficient: ±100ppm/℃; Operating Temperature: -55℃~+155℃
R67 = FRC0805F1503TS: 电阻类型:厚膜电阻;阻值:150kΩ;精度:±1%;功率:125mW;工作电压:150V;温度系数:±100ppm/℃;; LCSC Part Name: 150kΩ ±1% 125mW 厚膜电阻; Supplier Part: C2907228; Manufacturer: FOJAN(富捷); Supplier Footprint: 0805; JLCPCB Part Class: Extended Part; Supplier: LCSC; Type: 厚膜电阻; Tolerance: ±1%; Power(Watts): 125mW; Voltage-Supply(Max): 150V; Temperature Coefficient: ±100ppm/℃; Operating Temperature: -55℃~+155℃
U2 = H6-BGA-1219: componentDisplayMode: -1; SPLIT_INST: TRUE; SWAP_INFO: (S1+S2+S3+S4)
X1 = XL2EL89COI-111YLC-24M: 晶振类型:贴片晶振;频率:24MHz;常温频差:±10ppm;负载电容:12pF;频率稳定度:±20ppm;; LCSC Part Name: YSX321SL 24MHZ 4P 3225 12PF ±10PPM -40~85℃ (±20PPM); Supplier Part: C5444545; Manufacturer: YXC(扬兴晶振); Supplier Footprint: SMD3225-4P; JLCPCB Part Class: Extended Part; Datasheet: https://item.szlcsc.com/datasheet/XL2EL89COI-111YLC-24M/6336541.html; Supplier: LCSC; Type: 贴片晶振; Normal temperature Frequency Tolerance: ±10ppm; Load Capacitance: 12pF; Frequency Stability: ±20ppm; Operating Temperature: -40℃~+85℃
X2 = X321532768KGD2SI: 晶振类型:贴片晶振;频率:32.768kHz;常温频差:±20ppm;负载电容:12.5pF;频率稳定度:±30ppm;; LCSC Part Name: YST310S 32.768KHZ 2P 3215 12.5PF ±20PPM -40~85℃; Supplier Part: C620155; Manufacturer: YXC(扬兴晶振); Supplier Footprint: SMD3215-2P; JLCPCB Part Class: Extended Part; Datasheet: https://item.szlcsc.com/datasheet/X321532768KGD2SI/649983.html; Supplier: LCSC; Type: 贴片晶振; Normal temperature Frequency Tolerance: ±20ppm; Load Capacitance: 12.5pF; Frequency Stability: ±30ppm; Equivalent Series Resistance(ESR): 70kΩ; Operating Temperature: -40℃~+85℃
R23 = 0805W8F330JT5E: 电阻类型:厚膜电阻;阻值:33Ω;精度:±1%;功率:125mW;工作电压:150V;温度系数:±200ppm/℃;; LCSC Part Name: 33Ω ±1% 125mW 厚膜电阻; Supplier Part: C17634; Manufacturer: UNI-ROYAL(厚声); Supplier Footprint: 0805; JLCPCB Part Class: Basic Part; Datasheet: https://item.szlcsc.com/datasheet/0805W8F330JT5E/18322.html; Supplier: LCSC; Type: 厚膜电阻; Tolerance: ±1%; Power(Watts): 125mW; Voltage-Supply(Max): 150V; Temperature Coefficient: ±200ppm/℃; Operating Temperature: -55℃~+155℃
R13 = FRC0805F1000TS: 电阻类型:厚膜电阻;阻值:100Ω;精度:±1%;功率:125mW;工作电压:150V;温度系数:±100ppm/℃;; LCSC Part Name: 100Ω ±1% 125mW 厚膜电阻; Supplier Part: C2907218; Manufacturer: FOJAN(富捷); Supplier Footprint: 0805; JLCPCB Part Class: Extended Part; Datasheet: https://item.szlcsc.com/datasheet/FRC0805F1000TS/3180731.html; Supplier: LCSC; Type: 厚膜电阻; Tolerance: ±1%; Power(Watts): 125mW; Voltage-Supply(Max): 150V; Temperature Coefficient: ±100ppm/℃; Operating Temperature: -55℃~+155℃
R17 R18 R30 = 0805W8F2400T5E: 电阻类型:厚膜电阻;阻值:240Ω;精度:±1%;功率:125mW;工作电压:150V;温度系数:±100ppm/℃;; LCSC Part Name: 240Ω ±1% 125mW 厚膜电阻; Supplier Part: C17572; Manufacturer: UNI-ROYAL(厚声); Supplier Footprint: 0805; JLCPCB Part Class: Extended Part; Datasheet: https://item.szlcsc.com/datasheet/0805W8F2400T5E/18260.html; Supplier: LCSC; Type: 厚膜电阻; Tolerance: ±1%; Power(Watts): 125mW; Voltage-Supply(Max): 150V; Temperature Coefficient: ±100ppm/℃; Operating Temperature: -55℃~+155℃
R21 R22 R68 R69 = FRC0402F2001TS: 电阻类型:厚膜电阻;阻值:2kΩ;精度:±1%;功率:62.5mW;工作电压:50V;温度系数:±100ppm/℃;; LCSC Part Name: 2kΩ ±1% 62.5mW 厚膜电阻; Supplier Part: C2909344; Manufacturer: FOJAN(富捷); Supplier Footprint: 0402; JLCPCB Part Class: Extended Part; Datasheet: https://item.szlcsc.com/datasheet/FRC0402F2001TS/3186279.html; Supplier: LCSC; Type: 厚膜电阻; Tolerance: ±1%; Power(Watts): 62.5mW; Voltage-Supply(Max): 50V; Temperature Coefficient: ±100ppm/℃; Operating Temperature: -55℃~+155℃
UD2 = LPDDR3_FBGA178: componentDisplayMode: -1; SPLIT_INST: TRUE; SWAP_INFO: (S1+S2)
C1-C3 C16 = CL10A475KO8NNNC: 容值:4.7uF;精度:±10%;额定电压:16V;温度系数:X5R;; LCSC Part Name: 4.7uF ±10% 16V; Supplier Part: C19666; Manufacturer: SAMSUNG(三星); Supplier Footprint: 0603; JLCPCB Part Class: Basic Part; Datasheet: https://item.szlcsc.com/datasheet/CL10A475KO8NNNC/20375.html; Supplier: LCSC; Tolerance: ±10%; Voltage Rating: 16V; Temperature Coefficient: X5R
C11 = CC0603KRX7R9BB102: 容值:1nF;精度:±10%;额定电压:50V;材质(温度系数):X7R;; LCSC Part Name: 1nF ±10% 50V; Supplier Part: C100040; Manufacturer: YAGEO(国巨); Supplier Footprint: 0603; JLCPCB Part Class: Extended Part; Datasheet: https://atta.szlcsc.com/upload/public/pdf/source/20180910/C282072_33301C7F631E79921B82A8DAC6BCC5B3.pdf; Supplier: LCSC; Tolerance: ±10%; Voltage Rated: 50V; Temperature Coefficient: X7R
C25 = CL10A105KO8NNNC: 容值:1uF;精度:±10%;额定电压:16V;温度系数:X5R;; LCSC Part Name: 1uF ±10% 16V; Supplier Part: C1592; Manufacturer: SAMSUNG(三星); Supplier Footprint: 0603; JLCPCB Part Class: Extended Part; Datasheet: https://item.szlcsc.com/datasheet/CL10A105KO8NNNC/1944.html; Supplier: LCSC; Tolerance: ±10%; Voltage Rating: 16V; Temperature Coefficient: X5R
L1 L7-L10 = FXL0420-1R5-M: 电感值:1.5uH;精度:±20%;额定电流:5A;饱和电流(Isat):6A;类型:一体成型电感;; LCSC Part Name: 1.5uH ±20% 6A; Supplier Part: C167205; Manufacturer: cjiang(长江微电); Supplier Footprint: SMD,4.2x4.4mm; JLCPCB Part Class: Extended Part; Datasheet: https://atta.szlcsc.com/upload/public/pdf/source/20240426/3189EA8206330E2108542F9E34E540E7.pdf; Supplier: LCSC; Tolerance: ±20%; Rated Current: 5A; Saturation Current (Isat): 6A; DC Resistance (DCR): 46mΩ; Type: 一体成型电感
U1 = AXP805: Supplier Part: C5173627; Supplier Footprint: QFN-56(7x7); JLCPCB Part Class: Extended Part; Supplier: LCSC

## Nets
GND: C1.1 C2.1 C3.1 C4.1 C5.1 C6.1 C7.1 C8.1 C9.1 C10.1 C11.1 C12.1 C13.1 C14.1 C15.1 C16.1 C17.1 C18.1 C19.1 C20.1 C21.1 C25.2 C26.1 C27.1 C28.1 C29.1 C30.1 C31.1 C32.1 C33.1 C34.1 C35.1 C36.1 C37.1 C38.1 C39.1 C40.1 C41.1 C42.1 C43.1 C44.1 C45.1 C46.1 C47.1 C48.1 C49.1 C50.1 C51.1 C52.1 C53.1 C54.1 C55.1 C56.1 C57.1 C58.1 C59.1 C60.1 C61.1 C62.1 C63.1 C64.1 C65.1 C66.1 C67.1 C68.1 C69.1 C70.1 C71.1 C72.1 C73.1 C74.1 C75.1 C76.1 C77.1 C78.1 C79.1 C80.1 C81.1 C82.1 C83.1 C84.1 C85.1 C86.2 C87.2 C88.2 C89.2 C90.1 C91.1 C92.1 C93.1 C94.1 C95.1 C96.1 C97.1 C98.1 C99.1 C100.1 C101.1 C102.1 C103.1 C104.1 C105.1 C106.1 C107.1 C108.1 C109.1 C110.1 C111.1 C112.1 C113.1 C114.1 C115.1 C116.1 C117.1 C118.1 C119.1 C120.1 C121.1 C122.1 C137.1 C138.1 C139.2 C140.2 CN1.2(TMDS_DATA2_SHIELD) CN1.5(TMDS_DATA1_SHIELD) CN1.8(TMDS_DATA0_SHIELD) CN1.11(TMDS_CLOCK_SHIELD) CN1.17(DDC/CEC_GND) CN1.20(SHIELD) CN1.21(SHIELD) CN1.22(SHIELD) CN1.23(SHIELD) D2.3(GND) D2.8(GND) D3.3(GND) D3.8(GND) D6.3(GND) D6.8(GND) J1.7(NC) J1.8(CHS GND) J1.SH1 J1.SH2 R7.2 R17.1 R18.2 R21.1 R30.2 R65.1 R67.2 R69.1 U1.8(PGNDD) U1.11(PGNDE) U1.37(PGNDB) U1.38(PGNDB) U1.41(PGNDA) U1.42(PGNDA) U1.48(PGND) U1.49(PGND) U1.54(FBGND) U1.57(EP) U2.A1(AGND1) U2.A3(TV-OUT) U2.A16(GND2) U2.A21(GND3) U2.A23(GND4) U2.AA4(SRAS/SA16) U2.AA8(GND140) U2.AA11(SACT) U2.AA14(SWE/SA14) U2.AA16(GND141) U2.AA20(SBA1) U2.AA21(GND142) U2.AB3(GND143) U2.AB13(GND144) U2.AB21(GND145) U2.AC1(GND146) U2.AC5(GND147) U2.AC11(GND148) U2.AC19(GND149) U2.AC23(GND150) U2.C12(GND6) U2.C13(GND7) U2.C14(GND8) U2.C18(GND9) U2.C22(GND10) U2.D23(GND11) U2.E1(AGND2) U2.E3(AGND3) U2.E5(AGND4) U2.E13(GND17) U2.E15(GND18) U2.E16(GND19) U2.E18(GND20) U2.F12(GND21) U2.F13(GND22) U2.F14(GND23) U2.F15(GND24) U2.F16(GND25) U2.F17(GND26) U2.F21(GND27) U2.G7(GND1) U2.G9(GND28) U2.G15(GND29) U2.H1(GND30) U2.H7(GND31) U2.H8(GND32) U2.H9(GND33) U2.H10(GND34) U2.H12(GND35) U2.H15(GND36) U2.H16(GND37) U2.H23(GND38) U2.J7(GND39) U2.J8(GND40) U2.J9(GND41) U2.J10(GND42) U2.J11(GND43) U2.J12(GND44) U2.J15(GND45) U2.J16(GND46) U2.J17(GND47) U2.K7(GND48) U2.K8(GND49) U2.K9(GND50) U2.K10(GND51) U2.K11(GND52) U2.K12(GND53) U2.K13(GND54) U2.K14(GND55) U2.K15(GND56) U2.K16(GND57) U2.K17(GND58) U2.L7(GND59) U2.L9(GND60) U2.L10(GND61) U2.L11(GND62) U2.L12(GND63) U2.L13(GND64) U2.L14(GND65) U2.L15(GND66) U2.L18(GND67) U2.M1(GND68) U2.M7(GND69) U2.M10(GND70) U2.M11(GND71) U2.M12(GND72) U2.M13(GND73) U2.M14(GND74) U2.M15(GND75) U2.M18(GND76) U2.M23(GND77) U2.N7(GND78) U2.N10(GND79) U2.N11(GND80) U2.N12(GND81) U2.N13(GND82) U2.N14(GND83) U2.N15(GND84) U2.N18(GND85) U2.P7(GND86) U2.P10(GND87) U2.P11(GND88) U2.P12(GND89) U2.P13(GND90) U2.P14(GND91) U2.P20(GND92) U2.R8(GND93) U2.R9(GND94) U2.R10(GND95) U2.R11(GND96) U2.R12(GND97) U2.R13(GND98) U2.R14(GND99) U2.R15(GND100) U2.R17(GND101) U2.R18(GND102) U2.T7(GND103) U2.T8(GND104) U2.T9(GND105) U2.T10(GND106) U2.T11(GND107) U2.T12(GND108) U2.T13(GND109) U2.T14(GND110) U2.T15(GND111) U2.T16(GND112) U2.T18(GND113) U2.T19(GND114) U2.U6(GND115) U2.U7(GND116) U2.U9(GND117) U2.U10(GND118) U2.U11(GND119) U2.U12(GND120) U2.U15(GND121) U2.U17(GND122) U2.U18(GND123) U2.U22(GND124) U2.U23(GND125) U2.V5(GND126) U2.V7(GND127) U2.V13(GND128) U2.V17(GND129) U2.V19(GND130) U2.V20(GND131) U2.W1(GND132) U2.W3(GND133) U2.W5(SA13) U2.W7(SBA0) U2.W8(SBG0) U2.W10(GND134) U2.W16(SA12) U2.W17(SA11) U2.W19(SCAS/SA15) U2.W21(GND135) U2.W23(GND136) U2.Y5(GND137) U2.Y7(SA17) U2.Y13(GND138) U2.Y17(SA10) U2.Y19(GND139) UD2.B2(VSS_0) UD2.B5(VSS_1) UD2.B6(VSSQ_0) UD2.B12(VSSQ_1) UD2.C3(VSSCA_0) UD2.C5(VSS_2) UD2.C6(VSSQ_2) UD2.D3(VSSCA_1) UD2.D12(VSSQ_3) UD2.E4(VSS_3) UD2.E5(VSS_4) UD2.E6(VSSQ_4) UD2.F4(VSSCA_2) UD2.F5(VSS_5) UD2.F6(VSSQ_5) UD2.F12(VSSQ_6) UD2.G3(VSSCA_3) UD2.G4(VSSCA_4) UD2.G6(VSSQ_7) UD2.G9(VSSQ_8) UD2.H2(VSS_6) UD2.H10(VSSQ_9) UD2.J4(VSSCA_5) UD2.J12(VSS_7) UD2.K2(VSS_8) UD2.K10(VSSQ_10) UD2.L6(VSS_9) UD2.L9(VSSQ_11) UD2.M4(VSSCA_6) UD2.M5(VSS_10) UD2.M6(VSSQ_12) UD2.M12(VSSQ_13) UD2.N4(VSS_11) UD2.N5(VSS_12) UD2.N6(VSSQ_14) UD2.P3(VSSCA_7) UD2.P12(VSSQ_15) UD2.R4(VSS_13) UD2.R5(VSS_14) UD2.R6(VSSQ_16) UD2.T2(VSS_15) UD2.T3(VSS_16) UD2.T4(VSS_17) UD2.T5(VSS_18) UD2.T6(VSSQ_17) UD2.T12(VSSQ_18) X1.1 X1.3 ; also on sheet 6 7
VCC18-LPDDR3: C109.2 C110.2 C122.2 R6.2 UD2.A3(VDD1_0) UD2.A4(VDD1_1) UD2.A5(VDD1_2) UD2.A6(VDD1_3) UD2.A10(VDD1_8) UD2.U3(VDD1_4) UD2.U4(VDD1_5) UD2.U5(VDD1_6) UD2.U6(VDD1_7) UD2.U10(VDD1_9)
VCC18-RTC: C16.2 R4.1 R5.1 R6.1 R11.1 R56.1 U2.F20(VCC-RTC)
VCC-DRAM: C8.2 C93.2 C94.2 C95.2 C96.2 C97.2 C98.2 C99.2 C100.2 C101.2 C102.2 C103.2 C104.2 C105.2 C106.2 C107.2 C115.2 C116.2 C117.2 C118.2 C119.2 C120.2 C121.2 L7.1 R22.2 R68.2 U1.10(DCDCE) U2.U8(VCC-DRAM1) U2.U13(VCC-DRAM2) U2.U14(VCC-DRAM3) U2.U16(VCC-DRAM4) U2.V9(VCC-DRAM5) U2.V10(VCC-DRAM6) U2.V11(VCC-DRAM7) U2.V15(VCC-DRAM8) UD2.A8(VDD2_14) UD2.A9(VDD2_15) UD2.A11(VDDQ_0) UD2.C12(VDDQ_1) UD2.D4(VDD2_0) UD2.D5(VDD2_1) UD2.D6(VDD2_2) UD2.E8(VDDQ_2) UD2.E12(VDDQ_3) UD2.F2(VDDCA_0) UD2.G2(VDDCA_1) UD2.G5(VDD2_3) UD2.G12(VDDQ_4) UD2.H3(VDDCA_2) UD2.H5(VDD2_4) UD2.H6(VDD2_5) UD2.H8(VDDQ_5) UD2.H9(VDDQ_6) UD2.H11(VDDQ_7) UD2.H12(VDD2_16) UD2.J5(VDD2_6) UD2.J6(VDD2_7) UD2.J9(VDDQ_8) UD2.J10(VDDQ_9) UD2.K5(VDD2_8) UD2.K6(VDD2_9) UD2.K8(VDDQ_10) UD2.K11(VDDQ_11) UD2.K12(VDD2_17) UD2.L2(VDDCA_3) UD2.L5(VDD2_10) UD2.L12(VDDQ_12) UD2.M2(VDDCA_4) UD2.N8(VDDQ_13) UD2.N12(VDDQ_14) UD2.P4(VDD2_11) UD2.P5(VDD2_12) UD2.P6(VDD2_13) UD2.R12(VDDQ_15) UD2.U8(VDD2_18) UD2.U9(VDD2_19) UD2.U11(VDDQ_16)
VDD-CPU: C10.2 C15.2 C60.2 C61.2 C62.2 C68.2 C69.2 C70.2 L9.1 L10.1 U2.L16(VDD-CPU1) U2.L17(VDD-CPU2) U2.M16(VDD-CPU3) U2.M17(VDD-CPU4) U2.N16(VDD-CPU5) U2.N17(VDD-CPU6) U2.P15(VDD-CPU7) U2.P16(VDD-CPU8) U2.P17(VDD-CPU9)
VDD-CPUFB: U1.39(DCDCB) U1.40(DCDCA) U2.R16(VDD-CPUFB1) U2.T17(VDD-CPUFB2)
VDD-CPUS: C48.2 C49.2 C50.2 U2.F19(RTC-VIO) U2.K18(VDD-CPUS)
VDD-GPU: C21.2 C71.2 C72.2 C73.2 C74.2 C75.2 C76.2 L1.1 U2.L8(VDD-GPU1) U2.M8(VDD-GPU2) U2.M9(VDD-GPU3) U2.N8(VDD-GPU4) U2.N9(VDD-GPU5) U2.P8(VDD-GPU6) U2.P9(VDD-GPU7)
VDD-GPUFB: U1.47(DCDCC) U2.R7(VDD-GPUFB)
VDD-SYS: C6.2 C32.2 C38.2 C45.2 C46.2 C77.2 C78.2 C79.2 C80.2 C81.2 C82.2 L8.1 U1.9(DCDCD) U2.D18(VDD09-HDMI) U2.G12(VDD09-PCIE) U2.G13(VDD-SYS1) U2.G14(VDD-SYS2) U2.G16(VDD-USB) U2.H13(VDD-SYS3) U2.H14(VDD-SYS4) U2.J13(VDD-SYS5) U2.J14(VDD-SYS6)
AC-AVCC: C30.2 C42.2 C63.2 U2.D3(AC-AVCC)
AC-LDOIN: C17.2 C35.2 C40.2 C47.2 C53.2 C66.2 J1.9 J1.12 R1.2 R9.2 R10.2 U1.31(ALDO2) U2.B3(VCC-EPHY) U2.C3(TV-VCC) U2.E4(AC-LDOIN)
AC-VDD-IN: C54.2 C55.2 U2.D5(AC-SYS-VDD-OUT) U2.E6(AC-SYS-VDD-IN)
ALDO1: C18.2 C41.2 C52.2 C58.2 C64.2 C67.2 R2.1 R3.1 U1.28(ALDO1) U2.A22(DXVCCIO) U2.H6(VCC-PG) U2.H18(VCC-PL) U2.M19(VCC-PM)
ALDO3: C20.2 U1.32(ALDO3)
AP-NMI: C83.2 R56.2 U1.16(IRQ) U2.G21(NMI)
AP-RESET: C11.2 C84.2 R11.2 U1.15(PWROK) U2.G22(RESET) ; also on sheet 6
BIAS-ITEST: R7.1 U2.D20(ITEST)
BIAS-REXT: R67.1 U2.D21(REXT)
BIAS-VRAL: C85.2 U2.D19(VRAL)
BLDO1: C2.2 C31.2 C39.2 C51.2 C108.2 R14.2 U1.2(BLDO1) U2.E19(VCC18-BIAS) U2.P18(VCC-PLL) U2.W22(VDD18-DRAM)
BLDO2: C1.2 C43.2 C44.2 C59.2 C90.2 U1.1(BLDO2) U2.C19(VCC18-HDMI) U2.G11(VDD-EFUSE) U2.H11(VCC-PCIE) U2.N19(VCC-PC)
BLDO3: C3.2 U1.4(BLDO3)
CLDO1: C13.2 C26.2 C33.2 C37.2 D4.2(A) Q3.1(G) R8.1 R49.1 R52.1 R53.2 U1.19(CLDO1) U2.E14(VCC-USB) U2.G8(VCC-IO) ; also on sheet 7
CLDO2: C14.2 C36.2 U1.20(CLDO2) U2.R6(VCC-PD) ; also on sheet 6
CLDO3: C29.2 U1.17(CLDO3)
DCXO-LDOOUT: C65.2 U2.D22(DXLDO_OUT)
DCXO-XIN: C86.1 U2.B23(XIN) X1.4(GND)
DCXO-XOUT: C87.1 U2.B22(XOUT) X1.2(GND)
DDC_CEC_EN: R48.1 U2.E11(PH2/IR-TX/PCM0-DOUT/H-PCM0-DOUT/SIM1-PWREN)
EPHY-LNK-LED: R45.1 U2.B7(EPHY-LNK-LED)
EPHY-RXN: J1.6(RD-) U2.B6(EPHY-RXN)
EPHY-RXP: J1.3(RD+) U2.A6(EPHY-RXP)
EPHY-SPD-LED: R46.1 U2.C5(EPHY-SPD-LED)
EPHY-TXN: J1.2(TD-) U2.B5(EPHY-TXN)
EPHY-TXP: J1.1(TD+) U2.A5(EPHY-TXP)
HCEC: Q3.2(S) R53.1 U2.E9(PH10/HCEC)
HDMI-5V: C139.1 CN1.18(+5V) D5.2(A) D6.5(Line-4) D6.6(NC) R19.2 R33.2 R36.2
HDMI-CEC: CN1.13(CEC) D6.1(Line-1) D6.10(NC) Q3.3(D) R54.1
HDMI-SCL: CN1.15(SCL) D6.2(Line-2) D6.9(NC) Q1.3(D) R33.1
HDMI-SDA: CN1.16(SDA) D6.4(Line-3) D6.7(NC) Q2.3(D) R36.1
HHPD: C140.1 R47.1 U2.C20(HHPD)
HSCL: Q1.2(S) R49.2 U2.E10(PH8/HSCL)
HSDA: Q2.2(S) R52.2 U2.F7(PH9/HSDA)
HTX0N: CN1.9(TMDS_DATA0-) D3.2(Line-2) D3.9(NC) U2.B19(HTX0N)
HTX0P: CN1.7(TMDS_DATA0+) D3.1(Line-1) D3.10(NC) U2.A19(HTX0P)
HTX1N: CN1.6(TMDS_DATA1-) D2.5(Line-4) D2.6(NC) U2.B18(HTX1N)
HTX1P: CN1.4(TMDS_DATA1+) D2.4(Line-3) D2.7(NC) U2.A18(HTX1P)
HTX2N: CN1.3(TMDS_DATA2-) D2.2(Line-2) D2.9(NC) U2.B17(HTX2N)
HTX2P: CN1.1(TMDS_DATA2+) D2.1(Line-1) D2.10(NC) U2.A17(HTX2P)
HTXCN: CN1.12(TMDS_CLOCK-) D3.5(Line-4) D3.6(NC) U2.B20(HTXCN)
HTXCP: CN1.10(TMDS_CLOCK+) D3.4(Line-3) D3.7(NC) U2.A20(HTXCP)
KEYADC: C57.2 R14.1 U2.B21(KEYADC)
LINEOUTL: U2.D2(LINEOUTL) ; also on sheet 7
LINEOUTR: U2.D1(LINEOUTR) ; also on sheet 7
LXA: L10.2 U1.43(LXA) U1.44(LXA)
LXB: L9.2 U1.35(LXB) U1.36(LXB)
LXC: L1.2 U1.50(LXC) U1.51(LXC)
LXD: L8.2 U1.7(LXD)
LXE: L7.2 U1.12(LXE)
PMU-SCK: R2.2 U1.23(SCK) U2.K20(PL0/S-RSB-SCK/S-TWI-SCK)
PMU-SDA: R3.2 U1.24(SDA) U2.K23(PL1/S-RSB-SDA/S-TWI-SDA)
POWER: U1.27(EN) ; also on sheet 6
PWR-LED: U2.K21(PL4/S-JTAG-MS) ; also on sheet 6
SA0: U2.AA15(SA0) UD2.R2(CA0)
SA1: U2.AA17(SA1) UD2.P2(CA1)
SA2: U2.AA19(SA2) UD2.N2(CA2)
SA3: U2.Y20(SA3) UD2.N3(CA3)
SA4: U2.Y16(SA4) UD2.M3(CA4)
SA5: U2.Y10(SA5) UD2.F3(CA5)
SA6: U2.Y8(SA6) UD2.E3(CA6)
SA7: U2.AA5(SA7) UD2.E2(CA7)
SA8: U2.AA7(SA8) UD2.D2(CA8)
SA9: U2.Y3(SA9) UD2.C2(CA9)
SCKE0: U2.W14(SCKE0) UD2.K3(CKE0)
SCKE1: U2.Y11(SCKE1) UD2.K4(CKE1)
SCKN: R13.2 U2.AB12(SCKN) UD2.J2(CK_C)
SCKP: R13.1 U2.AC12(SCKP) UD2.J3(CK_T)
SCS0: U2.W13(SCS0) UD2.L3(CS0_N)
SCS1: U2.Y14(SCS1) UD2.L4(CS1_N)
SDC0-CLK: R23.2 ; also on sheet 7
SDC0-CMD: U2.G3(PF3/SDC0-CMD/JTAG-DO1) ; also on sheet 7
SDC0-D0: U2.F3(PF1/SDC0-D0/JTAG-DI1) ; also on sheet 7
SDC0-D1: U2.E2(PF0/SDC0-D1/JTAG-MS1) ; also on sheet 7
SDC0-D2: U2.G2(PF5/SDC0-D2/JTAG-CK1) ; also on sheet 7
SDC0-D3: U2.F1(PF4/SDC0-D3/UART0-RX) ; also on sheet 7
SDC0-DET: U2.C8(PF6) ; also on sheet 7
SDQ0: U2.AB18(SDQ0) UD2.P9(DQ0)
SDQ1: U2.AC17(SDQ1) UD2.M8(DQ4)
SDQ2: U2.AB17(SDQ2) UD2.N9(DQ1)
SDQ3: U2.AC16(SDQ3) UD2.N10(DQ2)
SDQ4: U2.AB15(SDQ4) UD2.N11(DQ3)
SDQ5: U2.AB14(SDQ5) UD2.M9(DQ5)
SDQ6: U2.AC14(SDQ6) UD2.M10(DQ6)
SDQ7: U2.AC13(SDQ7) UD2.M11(DQ7)
SDQ8: U2.AB19(SDQ8) UD2.R11(DQ23)
SDQ9: U2.AC20(SDQ9) UD2.T11(DQ19)
SDQ10: U2.AC21(SDQ10) UD2.T10(DQ18)
SDQ11: U2.AB20(SDQ11) UD2.R10(DQ22)
SDQ12: U2.AB23(SDQ12) UD2.T9(DQ17)
SDQ13: U2.AA23(SDQ13) UD2.R9(DQ21)
SDQ14: U2.AA22(SDQ14) UD2.T8(DQ16)
SDQ15: U2.Y22(SDQ15) UD2.R8(DQ20)
SDQ16: U2.AC6(SDQ16) UD2.E9(DQ14)
SDQ17: U2.AB6(SDQ17) UD2.F8(DQ11)
SDQ18: U2.AC7(SDQ18) UD2.F9(DQ10)
SDQ19: U2.AB7(SDQ19) UD2.D9(DQ15)
SDQ20: U2.AC9(SDQ20) UD2.F10(DQ9)
SDQ21: U2.AB9(SDQ21) UD2.E10(DQ13)
SDQ22: U2.AC10(SDQ22) UD2.F11(DQ8)
SDQ23: U2.AB10(SDQ23) UD2.E11(DQ12)
SDQ24: U2.Y1(SDQ24) UD2.C8(DQ27)
SDQ25: U2.Y2(SDQ25) UD2.B8(DQ31)
SDQ26: U2.AA1(SDQ26) UD2.C9(DQ26)
SDQ27: U2.AA2(SDQ27) UD2.B9(DQ30)
SDQ28: U2.AC2(SDQ28) UD2.B10(DQ29)
SDQ29: U2.AC3(SDQ29) UD2.B11(DQ28)
SDQ30: U2.AC4(SDQ30) UD2.C11(DQ24)
SDQ31: U2.AB4(SDQ31) UD2.C10(DQ25)
SDQM0: U2.AC18(SDQM0) UD2.L8(DM0)
SDQM1: U2.Y23(SDQM1) UD2.P8(DM2)
SDQM2: U2.AB11(SDQM2) UD2.G8(DM1)
SDQM3: U2.AB5(SDQM3) UD2.D8(DM3)
SDQS0N: U2.AB16(SDQS0N) UD2.L11(DQS0_C)
SDQS0P: U2.AC15(SDQS0P) UD2.L10(DQS0_T)
SDQS1N: U2.AB22(SDQS1N) UD2.P11(DQS2_C)
SDQS1P: U2.AC22(SDQS1P) UD2.P10(DQS2_T)
SDQS2N: U2.AC8(SDQS2N) UD2.G11(DQS1_C)
SDQS2P: U2.AB8(SDQS2P) UD2.G10(DQS1_T)
SDQS3N: U2.AB2(SDQS3N) UD2.D11(DQS3_C)
SDQS3P: U2.AB1(SDQS3P) UD2.D10(DQS3_T)
SODT0: U2.AA13(SODT0) UD2.J8(ODT)
STATUS-LED: U2.J21(PL7/S-JTAG-DI) ; also on sheet 6
SVREF: C91.2 C111.2 C112.2 C113.2 R68.1 R69.2 U2.V6(SVREF) UD2.H4(VREFCA)
SVREF_DQ: C92.2 C114.2 R21.2 R22.1 UD2.J11(VREFDQ)
UART0-RX: U2.D12(PH1/UART0-RX/PCM0-CLK/H-PCM0-CLK/SIM1-VPPPP) ; also on sheet 6
UART0-TX: U2.C9(PH0/UART0-TX/PCM0-SYNC/H-PCM0-SYNC/SIM1-VPPEN) ; also on sheet 6
UBOOT: U2.G17(UBOOT) ; also on sheet 6
USB0-DM: U2.A13(USB0-DM) ; also on sheet 7
USB0-DP: U2.B13(USB0-DP) ; also on sheet 7
USB0-DRVVBUS: U2.H20(PL6/S-JTAG-DO) ; also on sheet 7
USB1-AP-SSTXN: C23.1 U2.B15(USB1-SSTXN)
USB1-AP-SSTXP: C22.1 U2.C15(USB1-SSTXP)
USB1-DM: U2.B16(USB1-DM) ; also on sheet 7
USB1-DP: U2.C16(USB1-DP) ; also on sheet 7
USB1-SSRXN: U2.A14(USB1-SSRXN) ; also on sheet 7
USB1-SSRXP: U2.B14(USB1-SSRXP) ; also on sheet 7
USB1-SSTXN: C23.2 ; also on sheet 7
USB1-SSTXP: C22.2 ; also on sheet 7
USB3-DM: U2.A12(USB3-DM) ; also on sheet 7
USB3-DP: U2.B12(USB3-DP) ; also on sheet 7
USB-5V: C4.2 C5.2 C7.2 C9.2 C12.2 C19.2 C27.2 C28.2 D5.1(K) R19.1 U1.3(BLDOIN) U1.6(VIND) U1.13(VINE) U1.18(CLDOIN) U1.30(ALDOIN) U1.33(VINB) U1.34(VINB) U1.45(VINA) U1.46(VINA) U1.52(VINC) U1.53(VINC) ; also on sheet 6 7
VRA1: C34.2 U2.C4(VRA1)
VRA2: C56.2 U2.D4(VRA2)
X32KIN: C88.1 U2.F23(X32KIN) X2.2
X32KOUT: C89.1 U2.F22(X32KOUT) X2.1
$1N47: R17.2 U2.W2(SZQ)
$1N119: R18.1 UD2.B3(ZQ0)
$1N172: R30.1 UD2.B4(ZQ1)
$2N7: C137.2 J1.4
$2N9: C138.2 J1.5
$2N15: J1.10 R45.2
$2N16: J1.11 R46.2
$2N51: CN1.19(HOT_PLUG_DET) R47.2
$2N63: Q1.1(G) Q2.1(G) R48.2
$2N73: D4.1(K) R54.2
$3N65: R4.2 U1.25(VINT)
$3N68: R5.2 U1.26(PHSET)
$3N119: C25.1 U1.29(VREF)
$4N2: R8.2 R12.1
$4N5: R12.2 U2.P19(PC15/NAND-CE1)
$4N31: R23.1 U2.F2(PF2/SDC0-CLK/UART0-TX)
$5N38: R66.2 U2.B4(EPHY-RTX)
$5N74: R9.1 U2.E8(TEST1)
$5N75: R10.1 U2.C7(TEST2)
$5N76: R1.1 U2.E7(TEST3)
$5N200: R65.2 R66.1

Not connected (* = marked no-connect by the designer): CN1 14(UTILITY)*; U1 5(BLDO4)* 14(GPO)* 21(SWIN)* 22(SWOUT)* 55(MODESET)* 56(DCBSET)*; U2 A8(PCIE-REF-CLKP)* A9(PCIE-TXP)* A10(PCIE-RXP)* AA3(SRST)* AA10(SODT1)* B1(MIC2P)* B2(MIC2N)* B8(PCIE-REF-CLKM)* B9(PCIE-TXM)* B10(PCIE-RXM)* C1(MIC1P)* C2(MIC1N)* C23(REFCLK_OUT)* D9(PH6/SPI1-MISO/SPDIF-IN/TWI1-SDA/SIM1-DET)* D11(PH3/SPI1-CS/PCM0-DIN/H-PCM0-DIN/SIM1-CLK)* D15(HSIC-STR)* D16(HSIC-VCC)* E12(PH4/SPI1-CLK/PCM0-MCLK/H-PCM0-MCLK/SIM1-DATA)* E17(HSIC-DAT)* E21(CLOCK-SELECT)* E22(WREQIN)* F5(MBIAS)* F8(PH7/SPDIF-OUT)* F9(PH5/SPI1-MOSI/SPDIF-MCLK/TWI1-SCK/SIM1-RST)* F11(JTAGSEL0)* G10(JTAGSEL1)* G20(X32KFOUT)* H2(PG3/SDC1-D1)* H3(PG8/UART1-RTS/PLL-STA-DB/SIM0-VPPEN)* H4(PG6/UART1-TX)* H5(PG5/SDC1-D3)* H17(BOOT-SELECT)* H19(TEST)* H21(PL10/S-OWC/S-PWM1)* H22(PL8/S-PWM0)* J2(PG0/SDC1-CLK)* J3(PG1/SDC1-CMD)* J5(PG2/SDC1-D0)* J6(PG7/UART1-RX)* J19(PL9/S-IR-RX)* J20(PL3/S-UART-RX)* J22(PL5/S-JTAG-CK)* K1(PG9/UART1-CTS/PLL-TEST-GPIO/SIM0-VPPPP)* K2(PG11/PCM2-CLK/H-PCM2-CLK/SIM0-CLK/BIST-RESULT0)* K3(PG10/PCM2-SYNC/H-PCM2-SYNC/SIM0-PWREN)* K22(PL2/S-UART-TX)* L2(PG14/PCM2-MCLK/H-PCM2-MCLK/SIM0-DET/BIST-RESULT3)* L3(PG12/PCM2-DOUT/H-PCM2-DOUT/SIM0-DATA/BIST-RESULT1)* L4(PG13/PCM2-DIN/H-PCM2-DIN/SIM0-RST/BIST-RESULT2)* L5(PG4/SDC1-D2)* L6(PD2/LCD0-D4/TS0-SYNC/CSI-HSYNC/RGMII-RXD1/RMII-RXD1)* L19(PM4)* L20(PM0)* L21(PM1)* L22(PM2)* M2(PD4/LCD0-D6/TS0-D0/CSI-D0/RGMII-RXCK/RMII-NULL)* M3(PD1/LCD0-D3/TS0-ERR/CSI-MCLK/RGMII-RXD2/RMII-NULL)* M4(PD5/LCD0-D7/TS0-D1/CSI-D1/RGMII-RXCTL/RMII-CRS-DV)* M5(PD3/LCD0-D5/TS0-DVLD/CSI-VSYNC/RGMII-RXD0/RMII-RXD0)* M6(PD10/LCD0-D14/TS0-D6/CSI-D6/RGMII-TXD0/RMII-TXD0)* M21(PC5/NAND-RB0/SDC2-CMD/SPI0-CS)* M22(PM3)* N2(PD6/LCD0-D10/TS0-D2/CSI-D2/RGMII-NULL/RMII-RXER)* N3(PD0/LCD0-D2/TS0-CLK/CSI-PCLK/RGMII-RXD3/RMII-NULL)* N20(PC4/NAND-RE/SDC2-CLK)* N22(PC6/NAND-DQ0/SDC2-D0/SPI0-HOLD)* N23(PC7/NAND-DQ1/SDC2-D1/SPI0-WP)* P1(PD11/LCD0-D15/TS0-D7/CSI-D7/RGMII-TXCK/RMII-TXCK)* P2(PD9/LCD0-D13/TS0-D5/CSI-D5/RGMII-TXD1/RMII-TXD1)* P3(PD19/LCD0-DE/TS2-SYNC/UART2-TX/MDC)* P4(PD18/LCD0-CLK/TS2-ERR/DMIC-DATA3)* P5(PD8/LCD0-D12/TS0-D4/CSI-D4/RGMII-TXD2/RMII-NULL)* P6(PD13/LCD0-D19/TS1-ERR/CSI-SDA/RGMII-CLKIN/RMII-NULL)* P21(PC16/NAND-RB1)* P22(PC2/NAND-CLE/SPI0-MOSI)* R2(PD16/LCD0-D22/TS1-D0/DMIC-DATA1)* R3(PD15/LCD0-D21/TS1-DVLD/DMIC-DATA0/CSI-D9)* R5(PD26/TWI0-SDA/TS3-D0/UART3-CTS/JTAG-DI)* R19(PC14/NAND-DQS/SDC2-RST)* R20(PC1/NAND-ALE/SDC2-DS)* R21(PC0/NAND-WE/SPI0-CLK)* R22(PC8/NAND-DQ2/SDC2-D2)* R23(PC9/NAND-DQ3/SDC2-D3)* T1(PD7/LCD0-D11/TS0-D3/CSI-D3/RGMII-TXD3/RMII-NULL)* T2(PD17/LCD0-D23/TS2-CLK/DMIC-DATA2)* T3(PD21/LCD0-VSYNC/TS2-D0/UART2-RTS)* T20(PC3/NAND-CE0/SPI0-MISO)* T21(PC11/NAND-DQ5/SDC2-D5)* T22(PC10/NAND-DQ4/SDC2-D4)* U2(PD22/PWM0/TS3-CLK/UART2-CTS)* U3(PD25/TWI0-SCK/TS3-DVLD/UART3-RTS/JTAG-DO)* U4(PD14/LCD0-D20/TS1-SYNC/DMIC-CLK/CSI-D8)* U5(PD23/TWI2-SCK/TS3-ERR/UART3-TX/JTAG-MS)* U19(PC12/NAND-DQ6/SDC2-D6)* U21(PC13/NAND-DQ7/SDC2-D7)* V1(PD24/TWI2-SDA/TS3-SYNC/UART3-RX/JTAG-CK)* V2(PD12/LCD0-D18/TS1-CLK/CSI-SCK/RGMII-TXCTL/RMII-TXEN)* V3(PD20/LCD0-HSYNC/TS2-DVLD/UART2-RX/MDIO)* V21(PLLTEST)* V22(X24MIN)* V23(X24MOUT)* W4(SPAR)* W11(SBG1)* Y21(SALERT)*; UD2 A1(NC0)* A2(NC1)* A12(NC2)* A13(NC3)* B1(NC4)* B13(NC5)* C4(NC6)* K9(NC7)* R3(NC8)* T1(NC9)* T13(NC10)* U1(NC11)* U2(NC12)* U12(NC13)* U13(NC14)*

## Notes on the sheets
sheet 1
- H6-LPDDR3
- LPDDR3
- LPDDR3电源
- 绿波电龙
- 靠近DDR
- 靠近H6
sheet 3
- BLDO
- CLDO
- DCDCC
- 连接标识处
- DCDC
- AXP805
- 0.9V
- DCDCD
- ALDO
- 0.9V
- 1.8V
- 连接标识处
- LDO
- 3.3V
- 1.8V
- DCDCE
- 1.2V
- DCDCB
- DCDCA
sheet 5
- PCLE,USB,HDMI,EPHY,CODEC
- 绿波电龙
- 电源部分
- 晶振
